# Altium project RADAR_D79_R9_UNIFIED_FLAT.PrjPcb
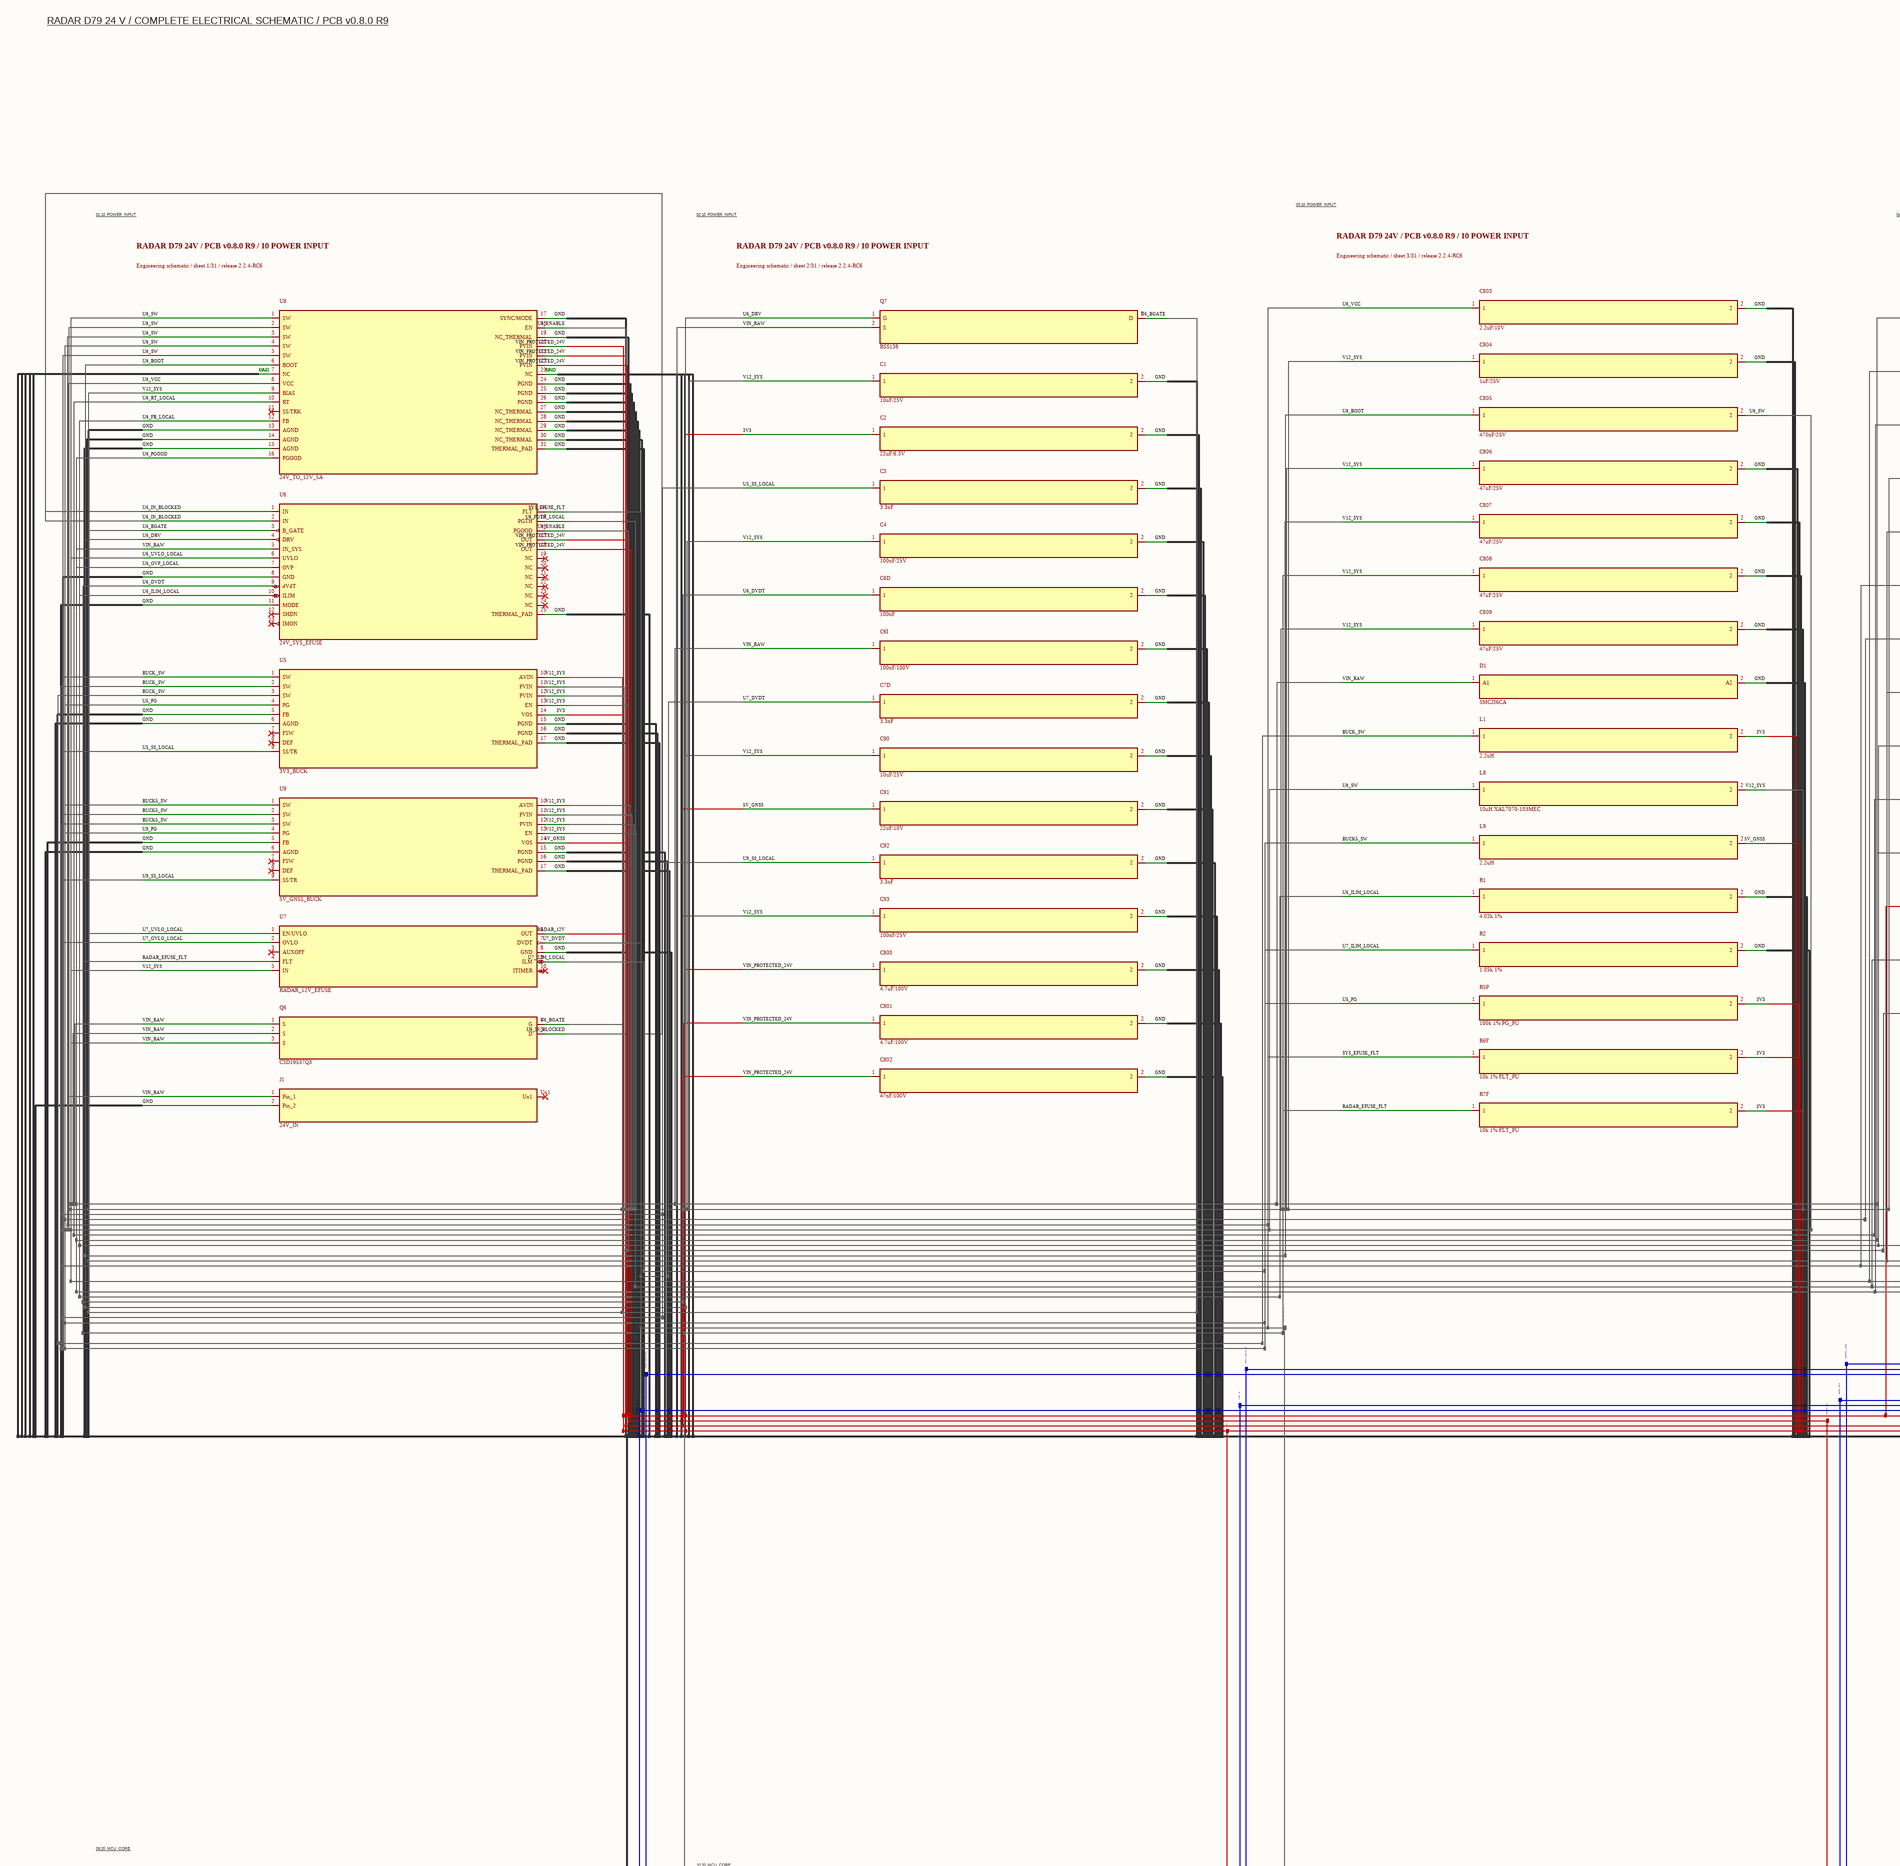
[diagram p0: 00_UNIFIED_CONNECTED_SCHEMATIC.SchDoc, top left]
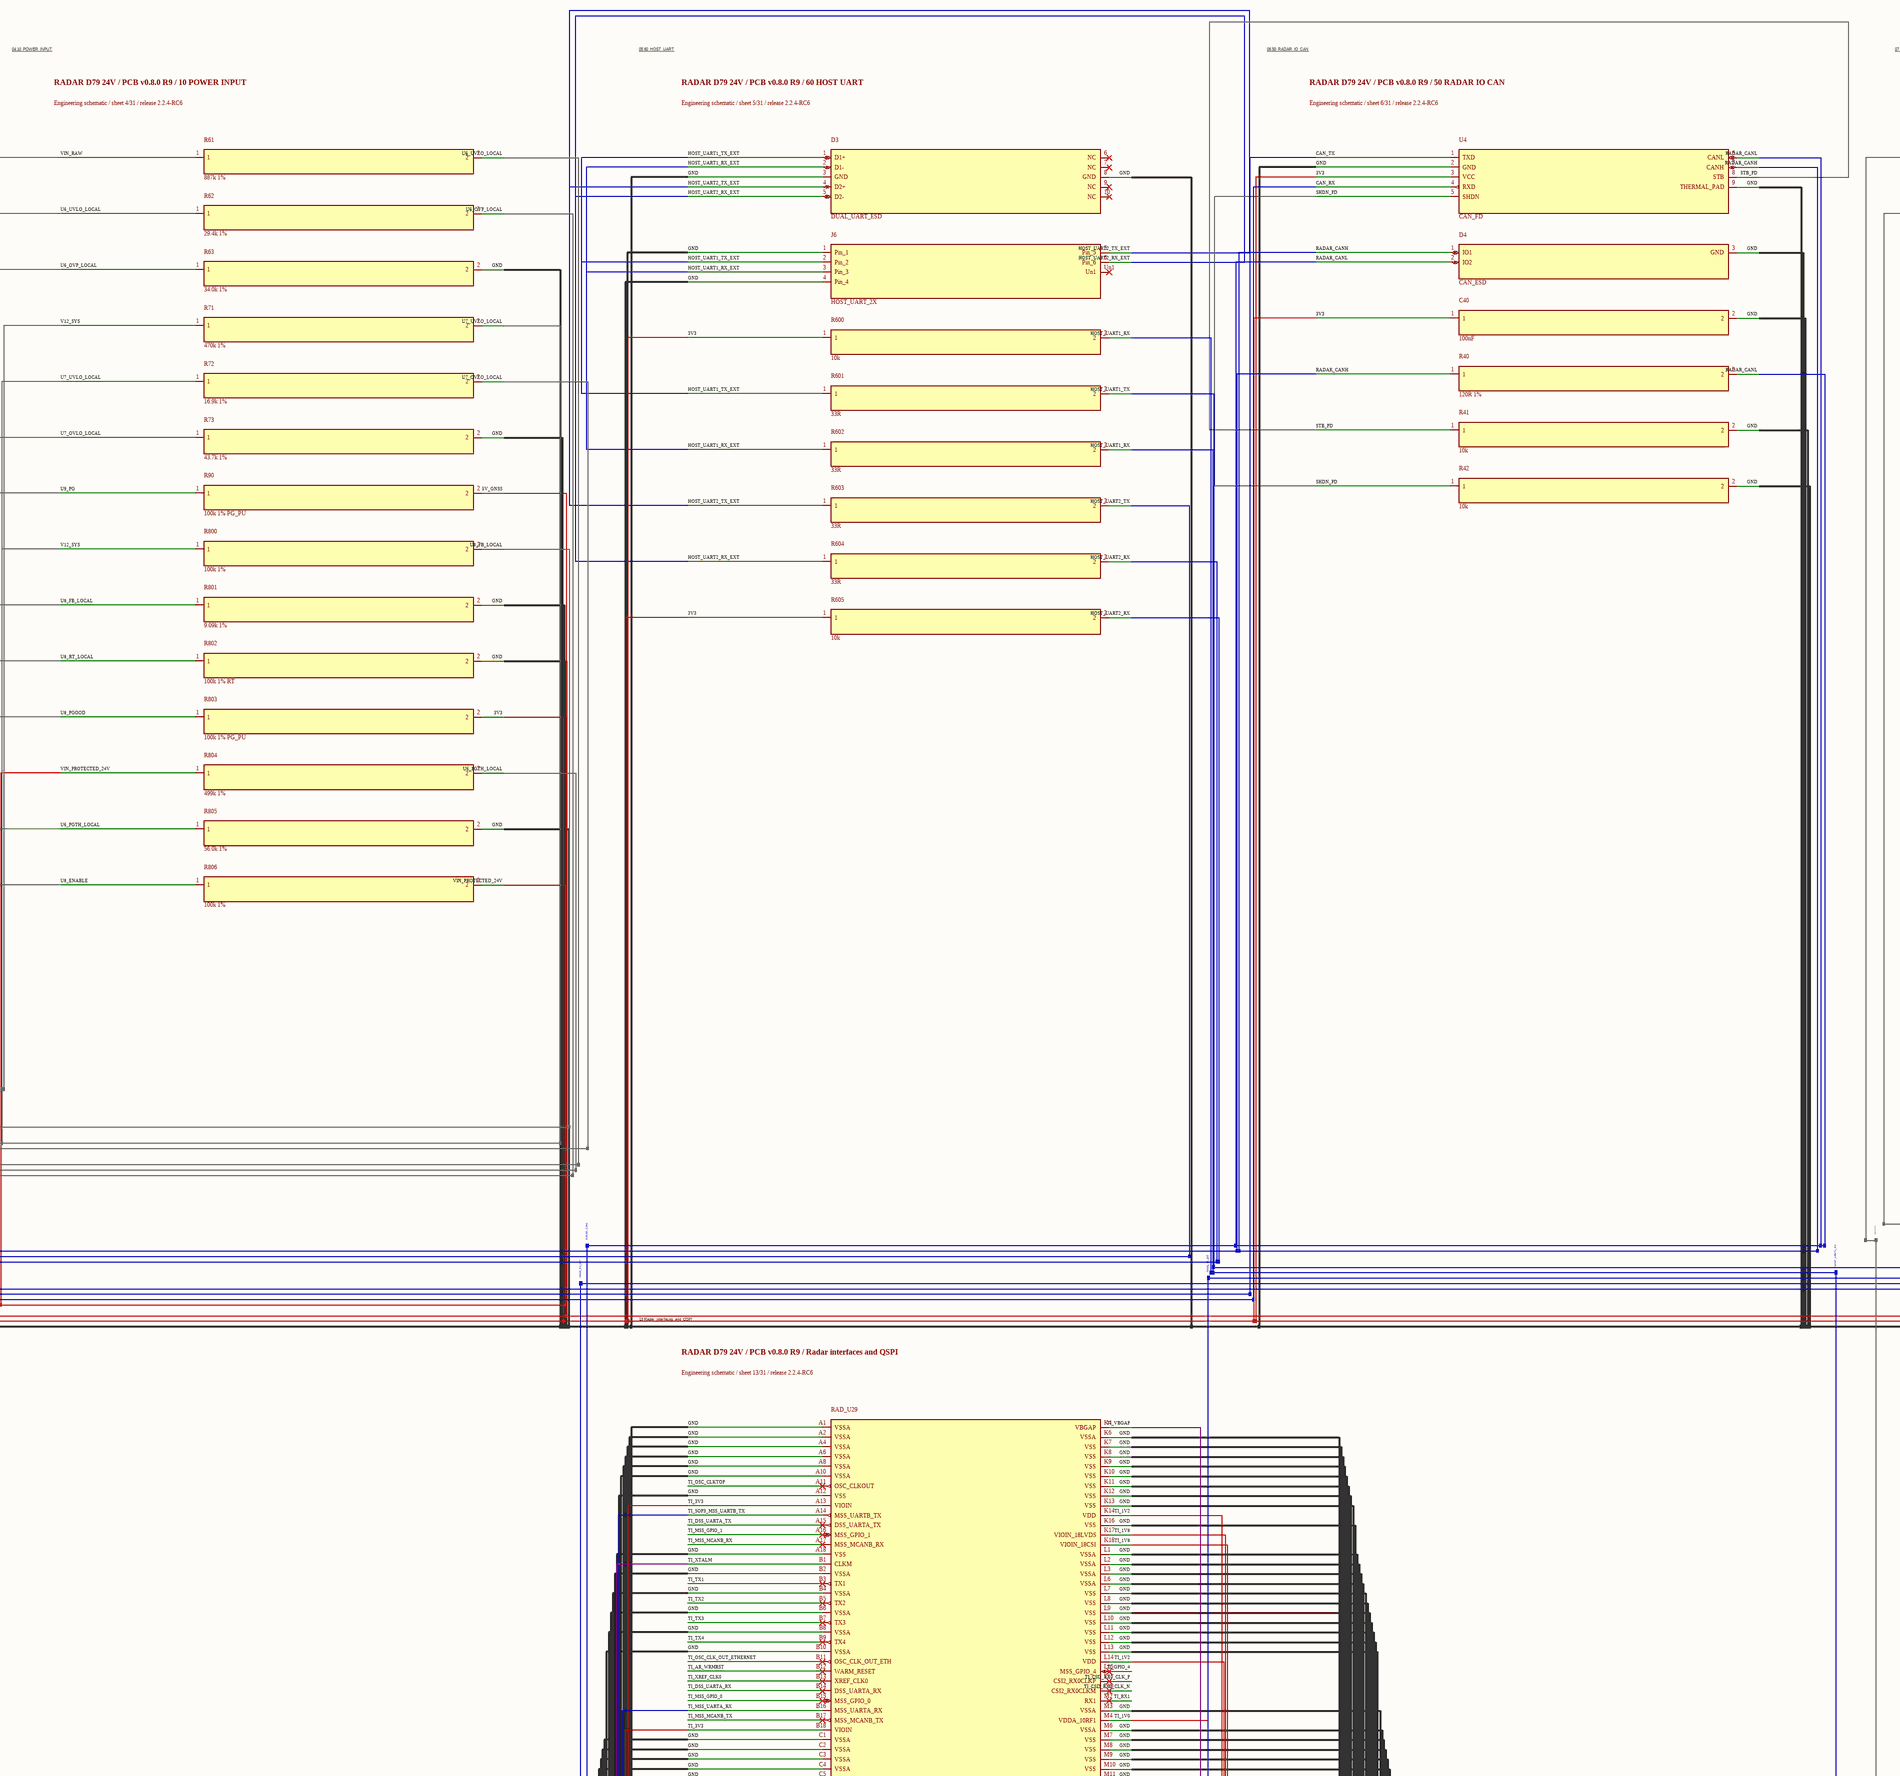
[diagram p1: 00_UNIFIED_CONNECTED_SCHEMATIC.SchDoc, top middle]
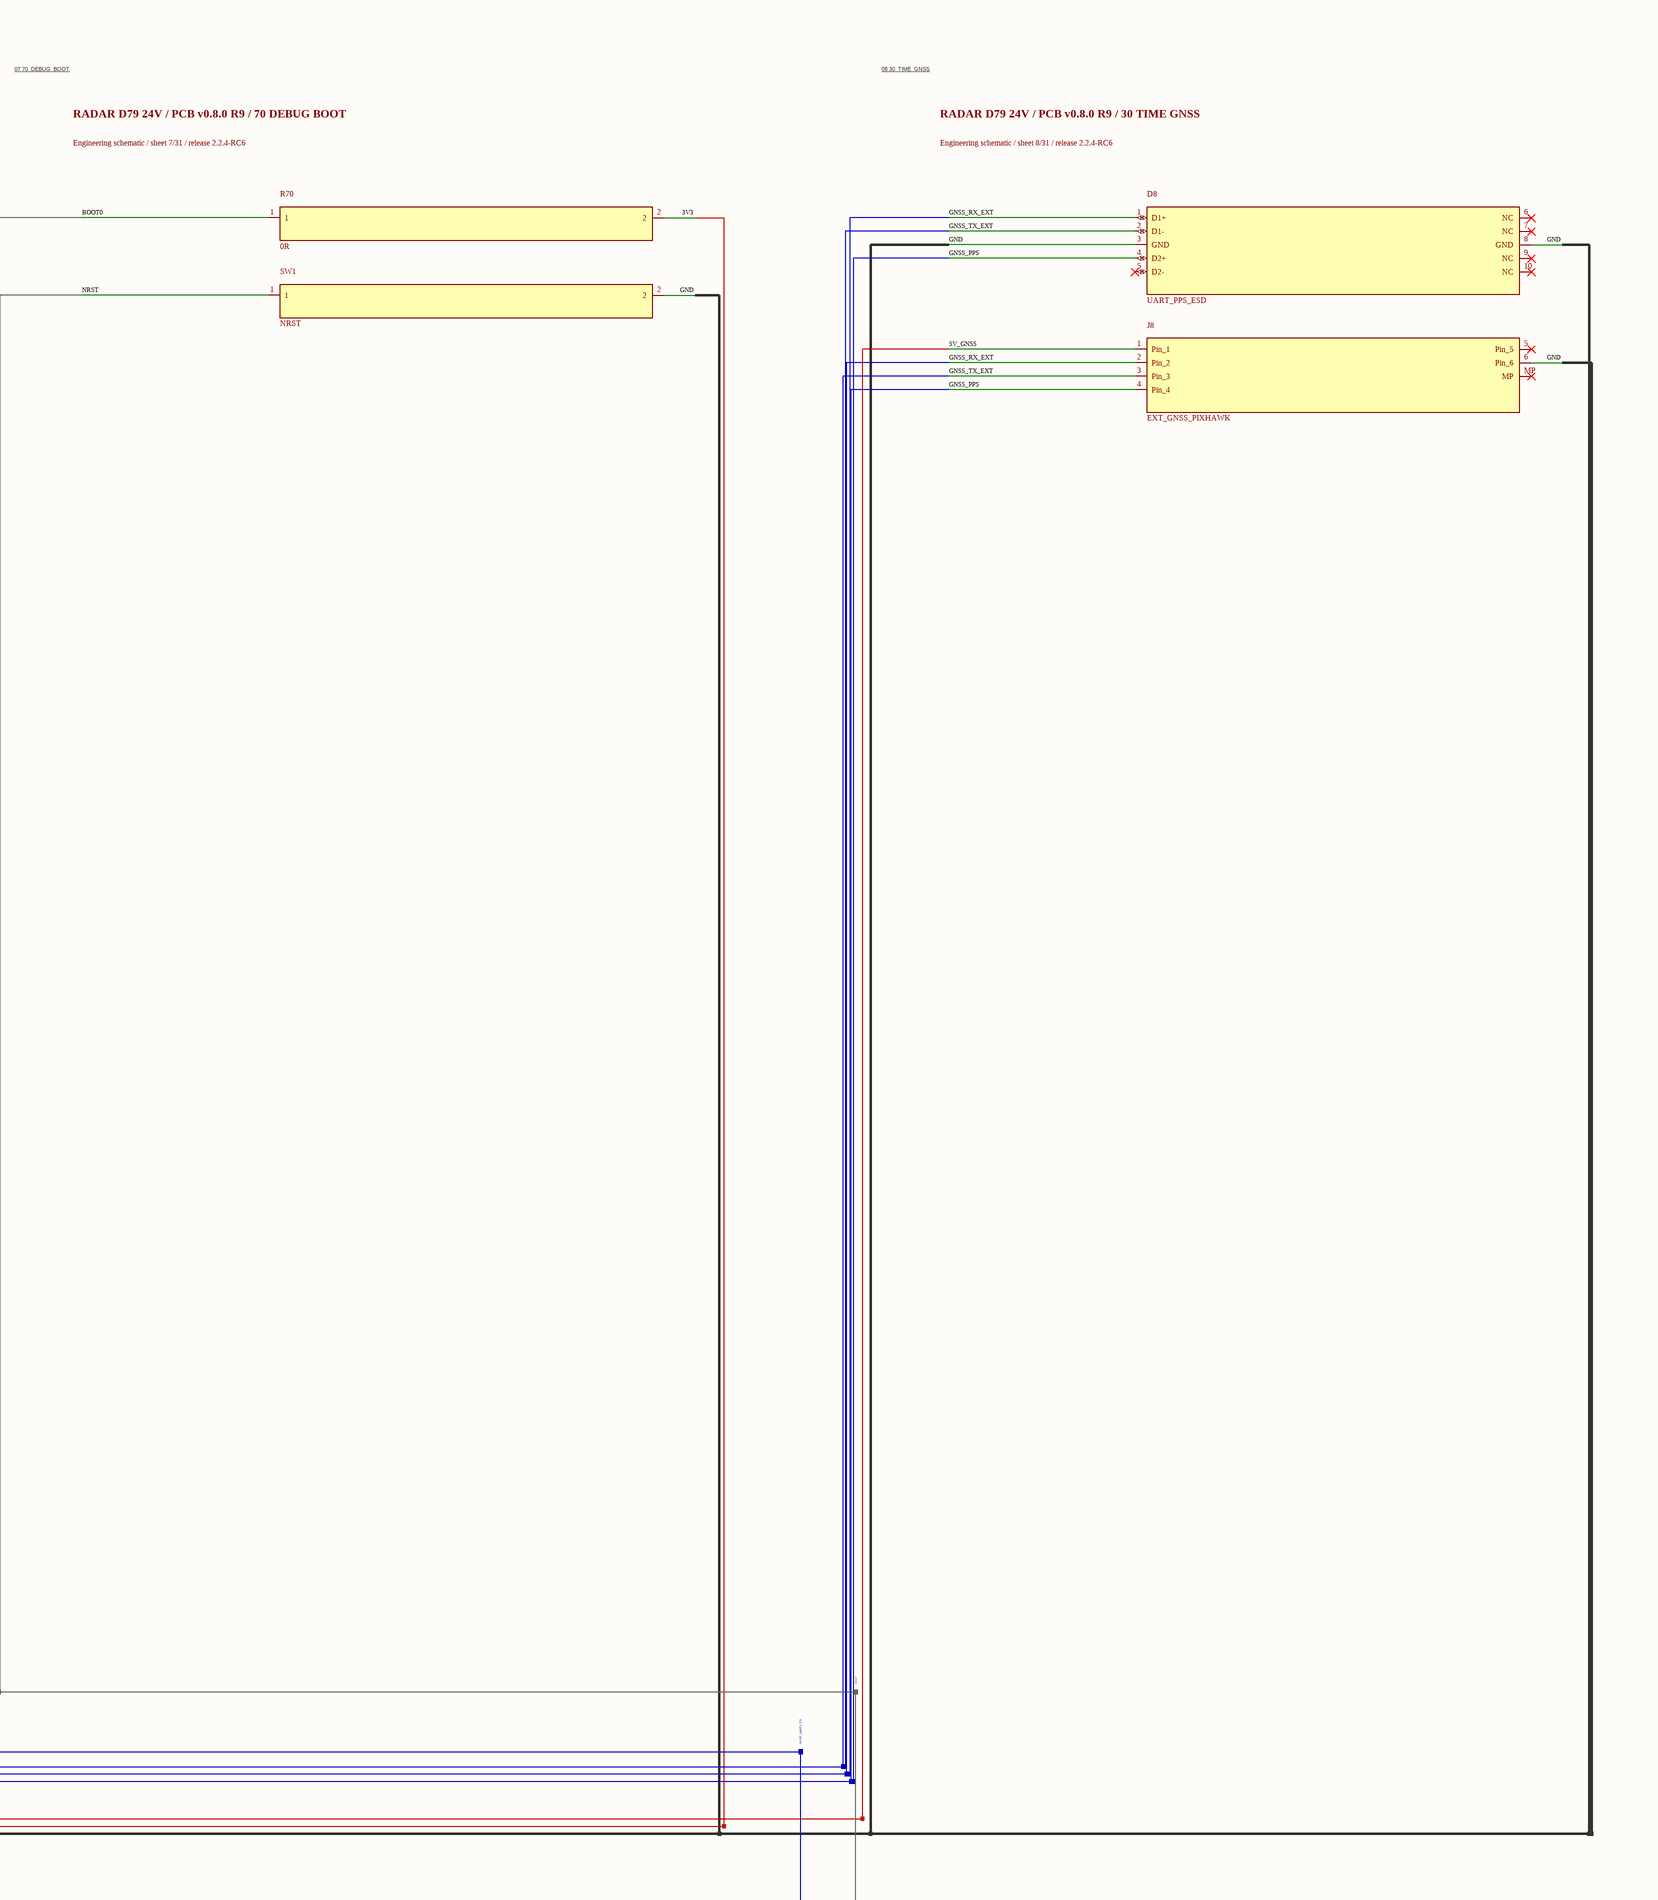
[diagram p2: 00_UNIFIED_CONNECTED_SCHEMATIC.SchDoc, top right]
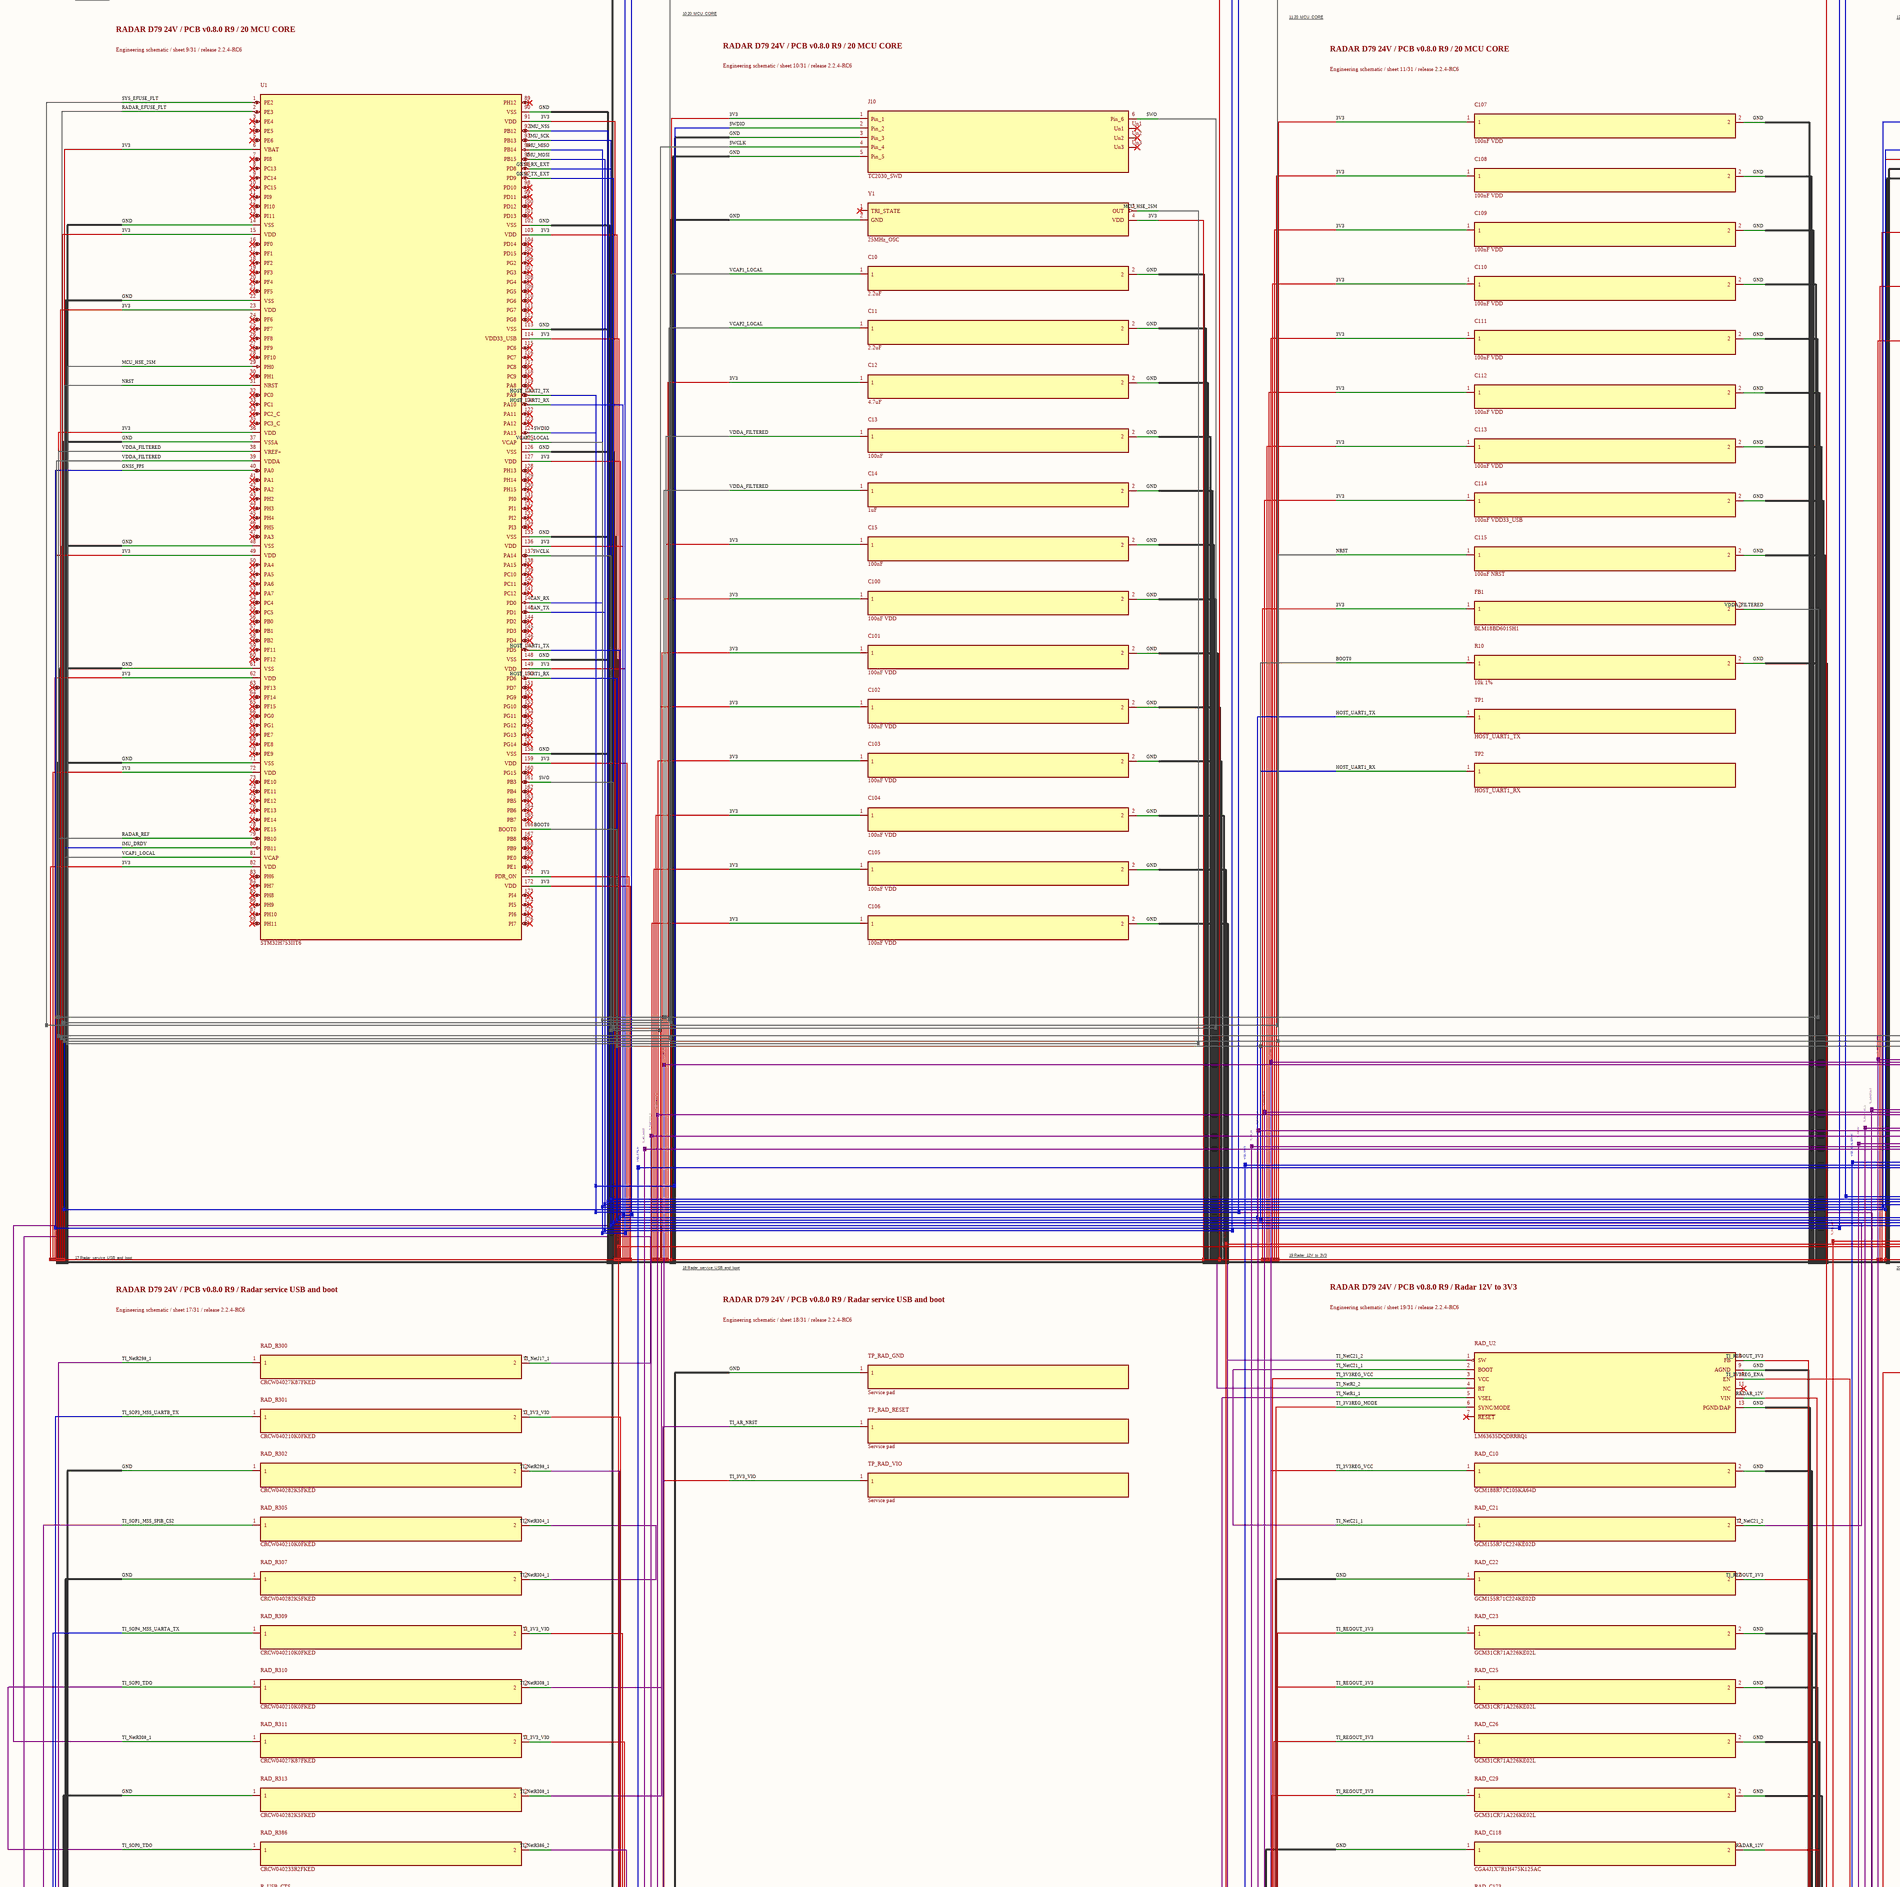
[diagram p3: 00_UNIFIED_CONNECTED_SCHEMATIC.SchDoc, centre left]
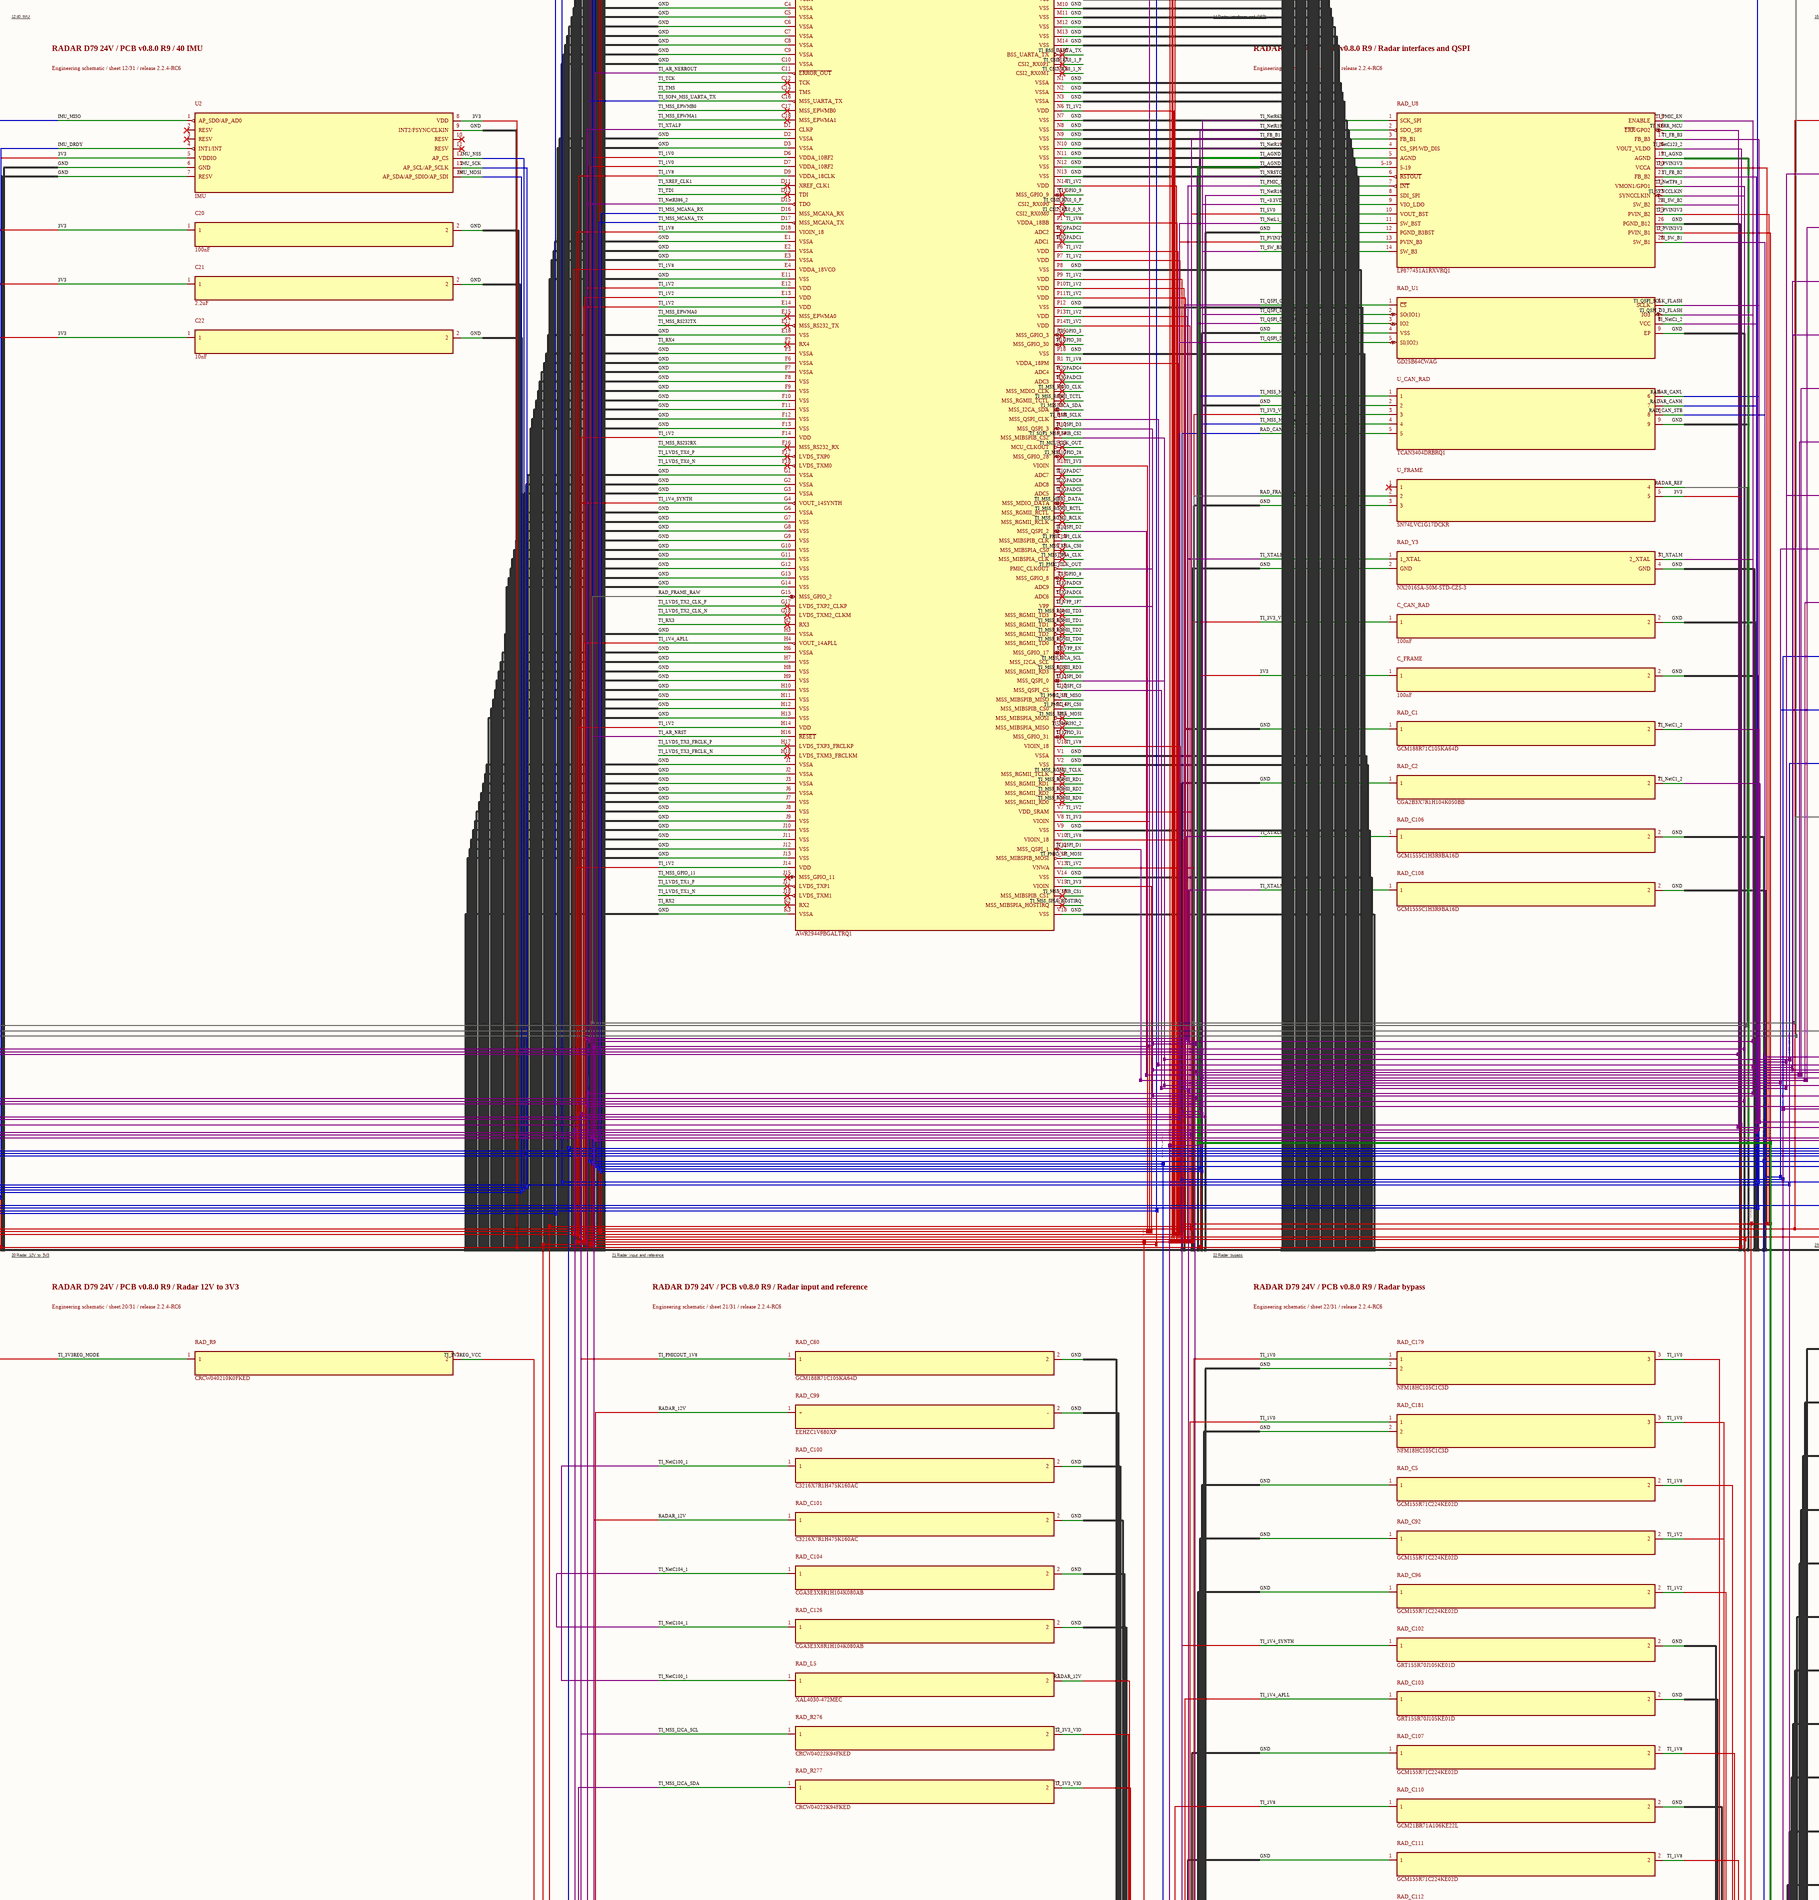
[diagram p4: 00_UNIFIED_CONNECTED_SCHEMATIC.SchDoc, centre middle]
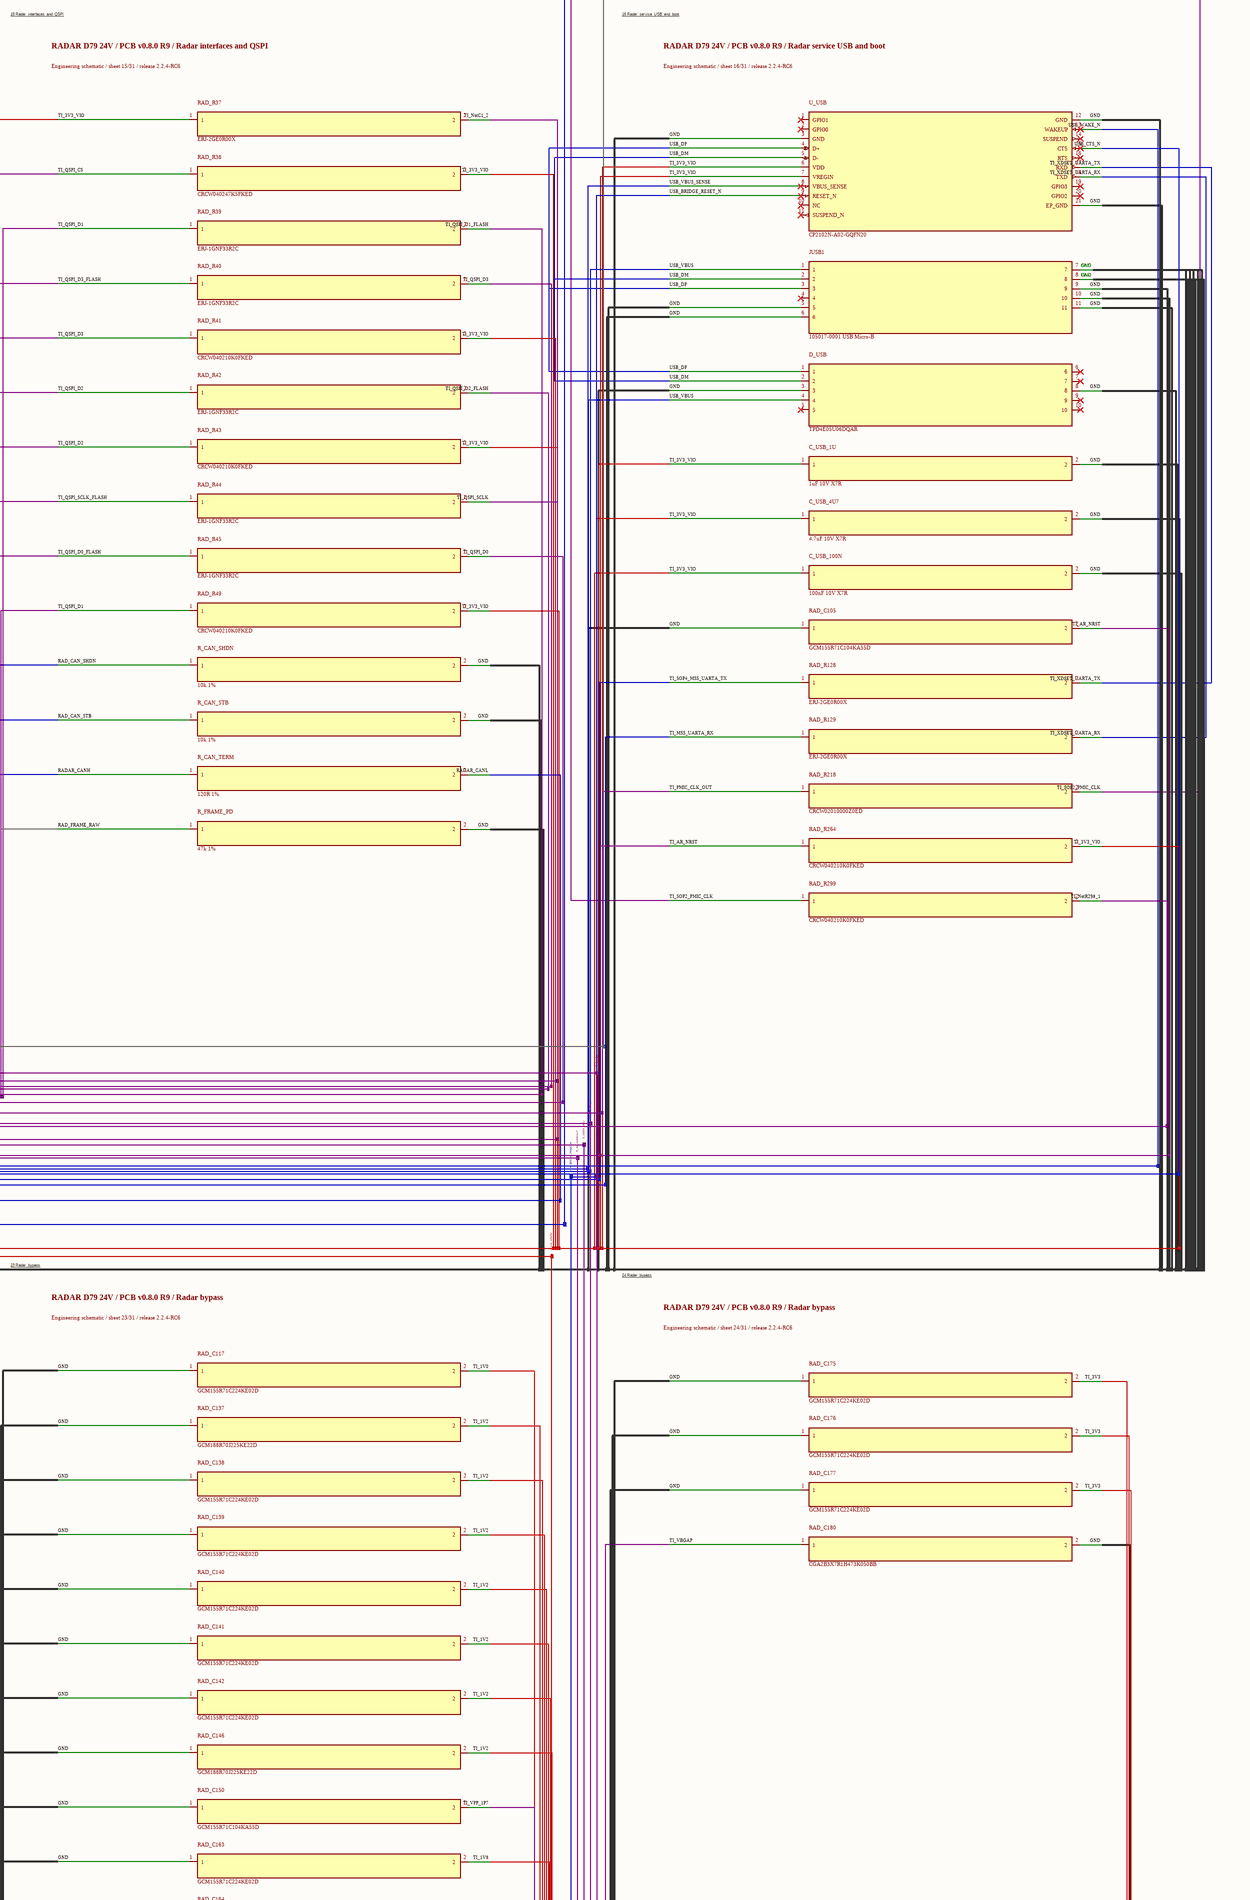
[diagram p5: 00_UNIFIED_CONNECTED_SCHEMATIC.SchDoc, centre right]
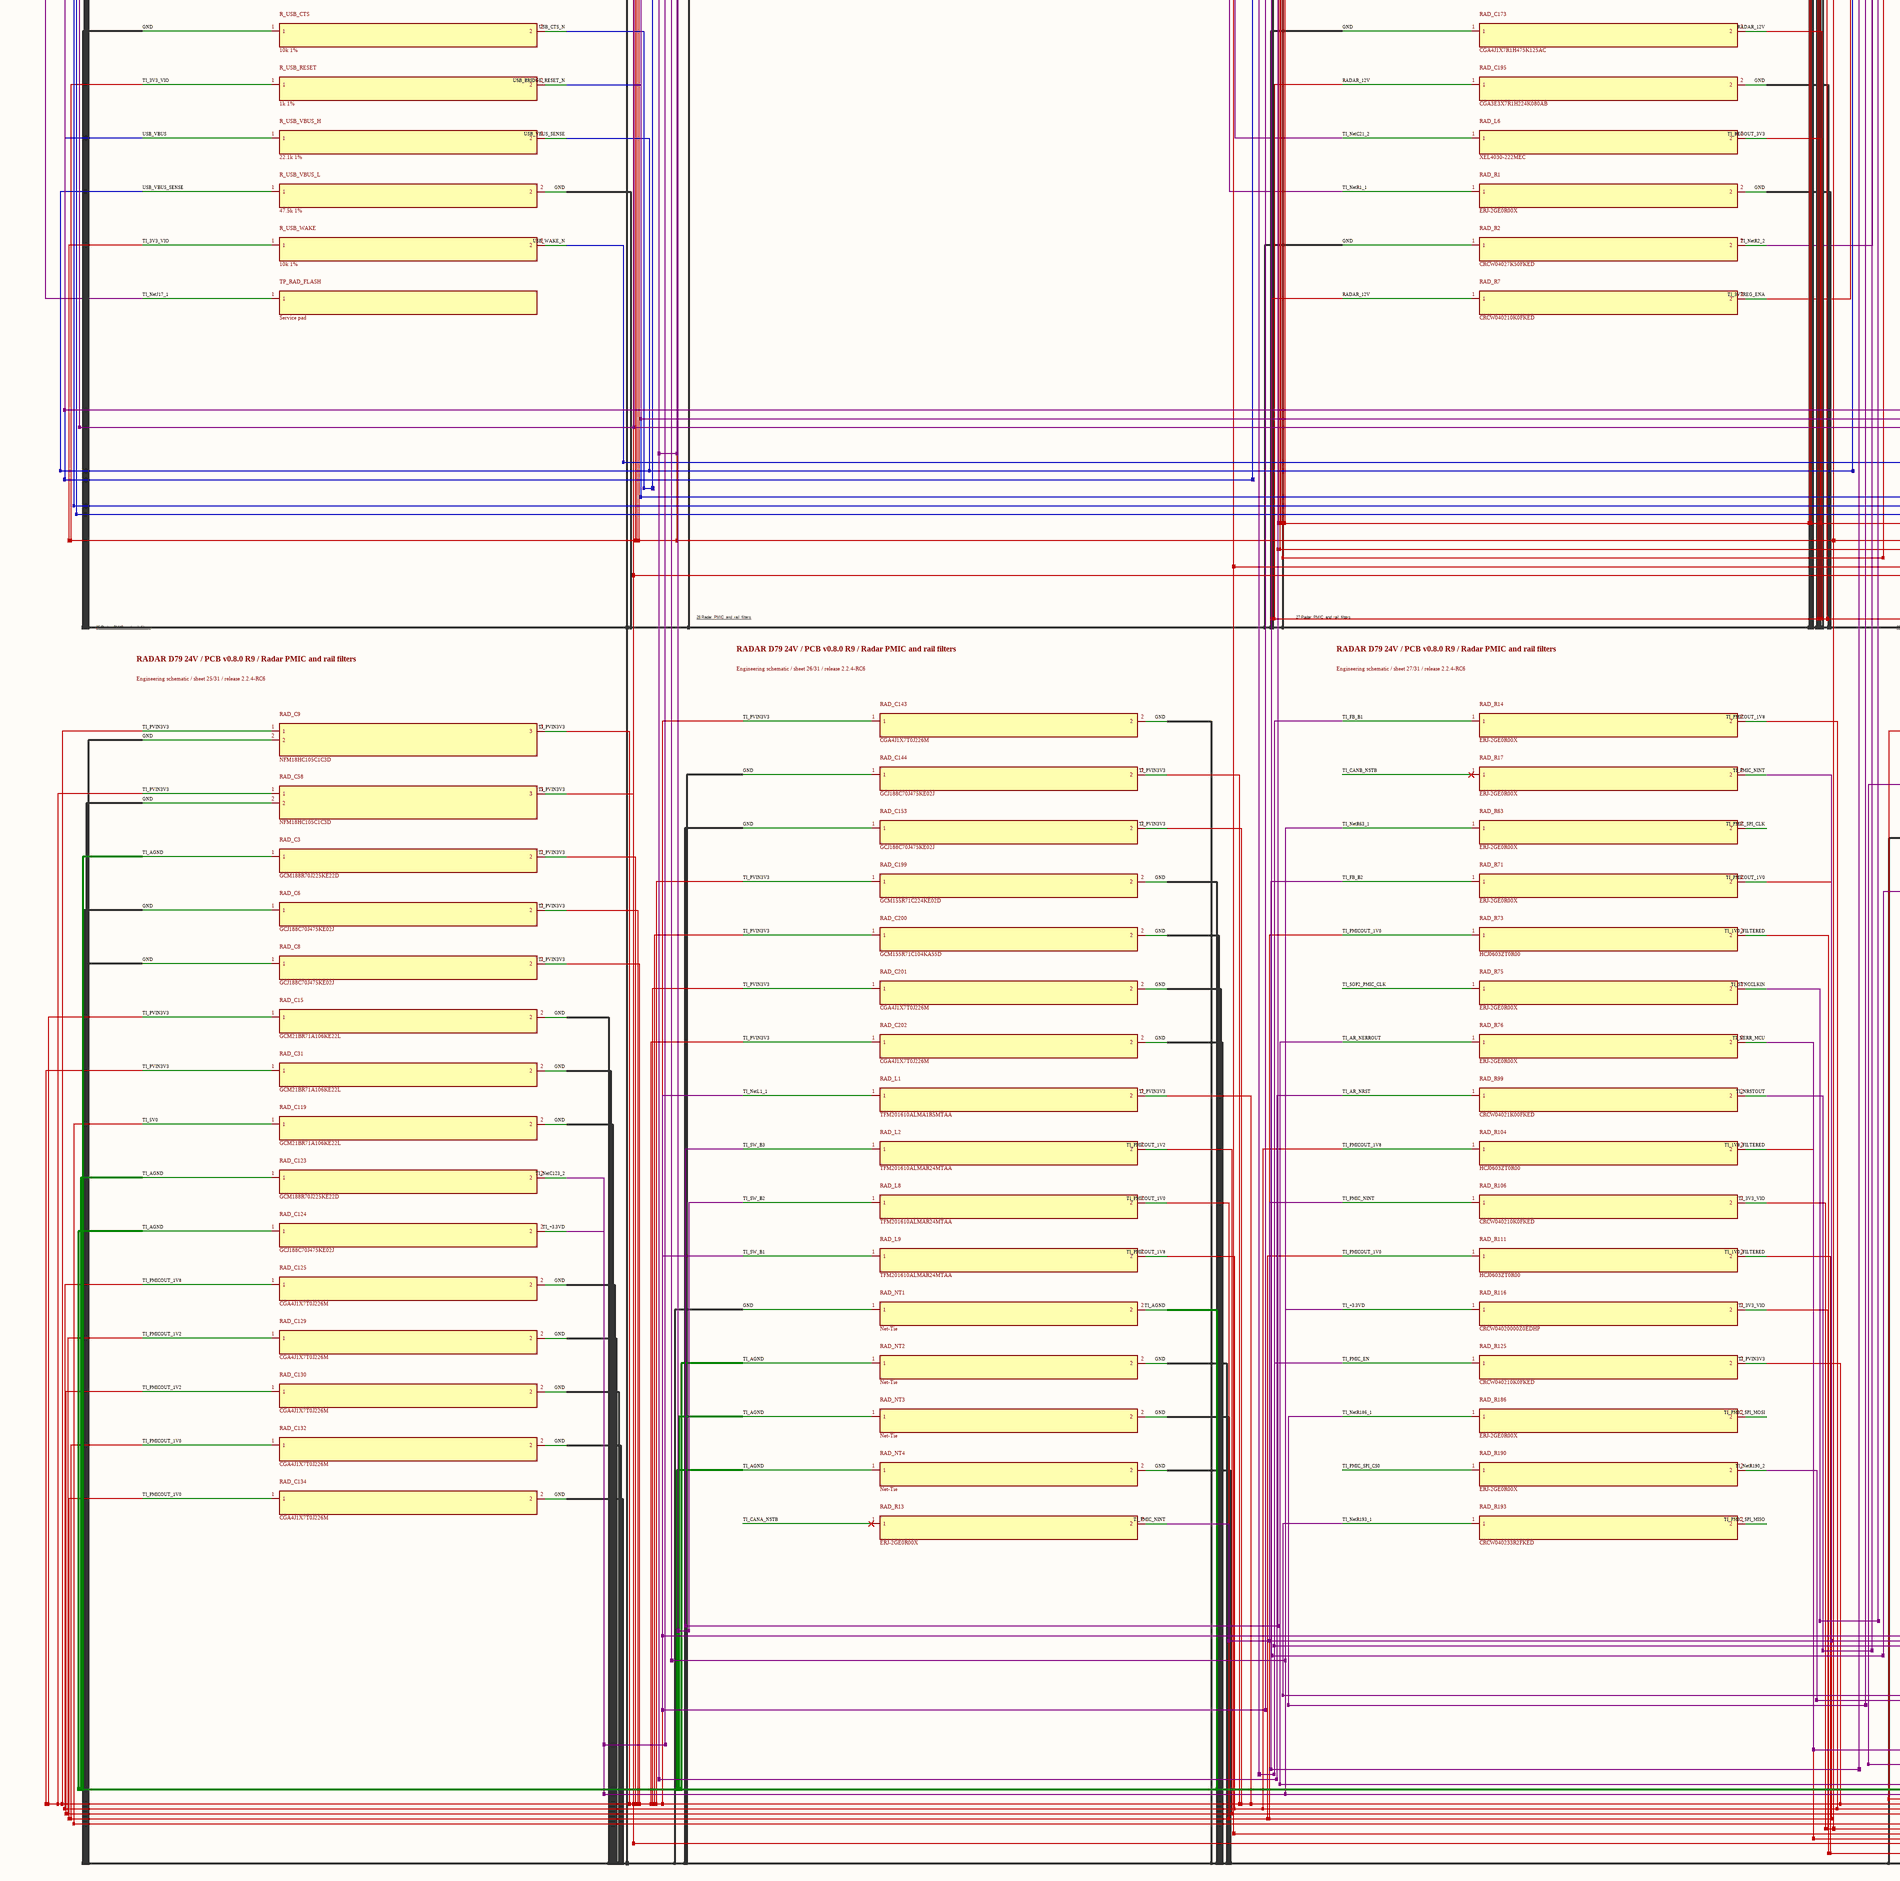
[diagram p6: 00_UNIFIED_CONNECTED_SCHEMATIC.SchDoc, bottom left]
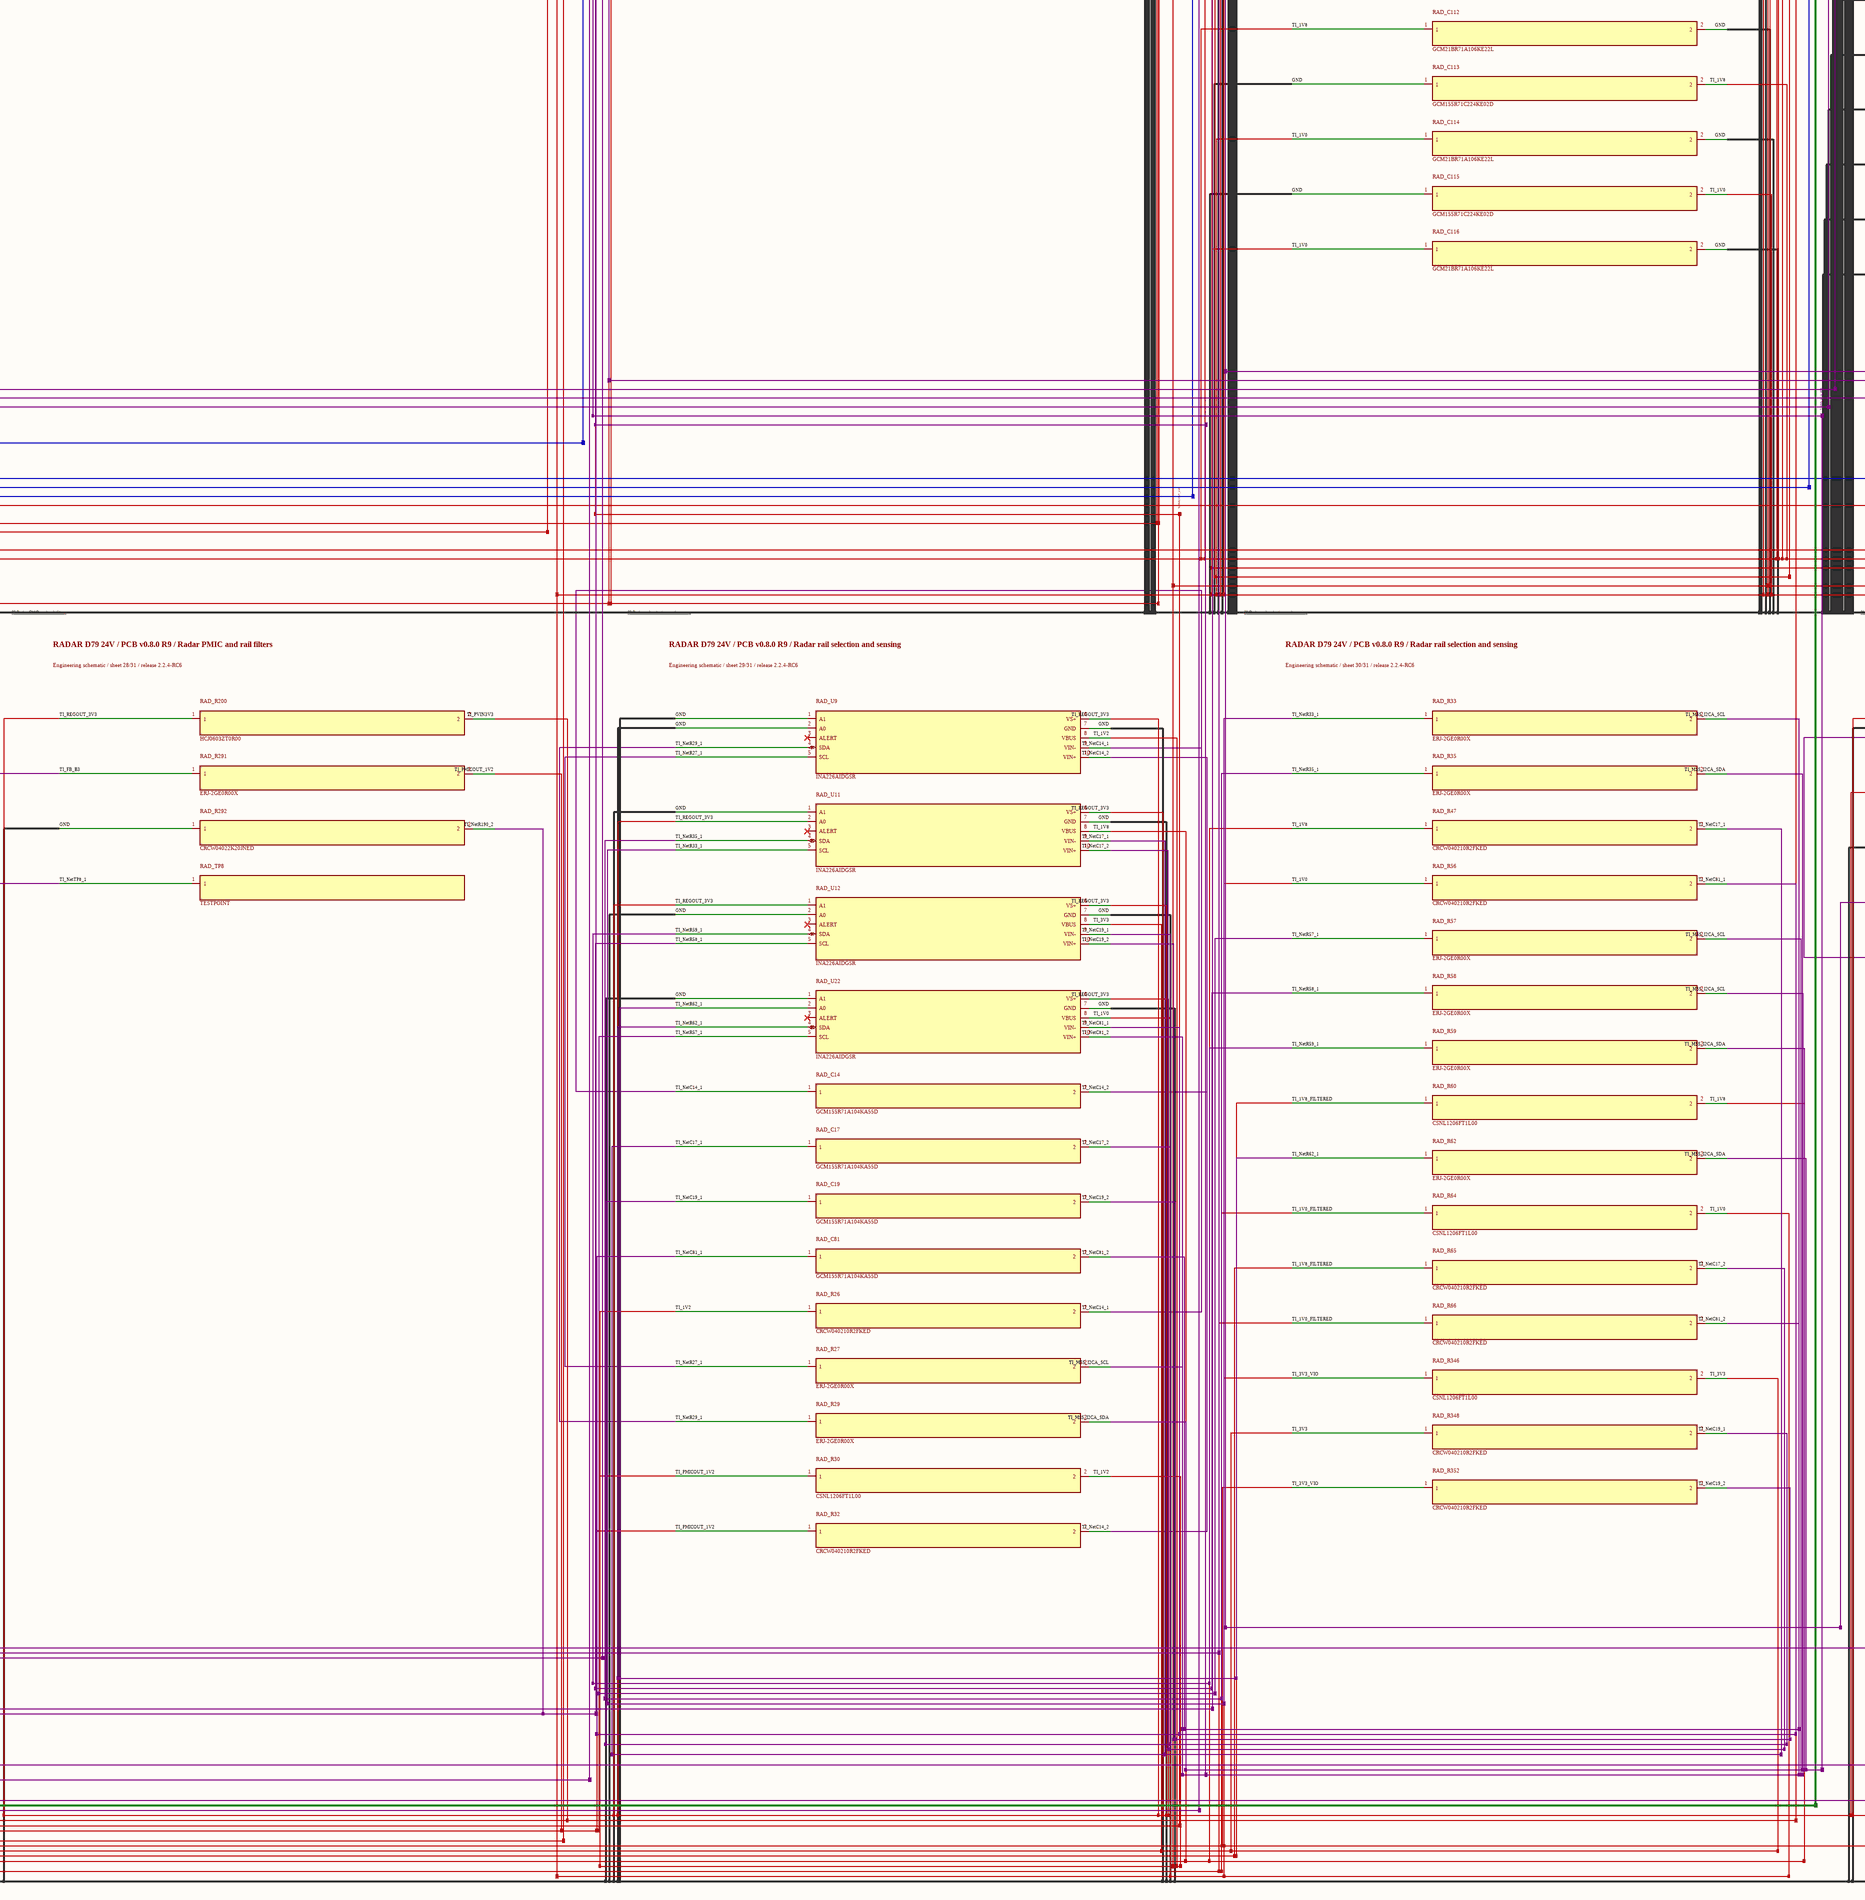
[diagram p7: 00_UNIFIED_CONNECTED_SCHEMATIC.SchDoc, bottom middle]
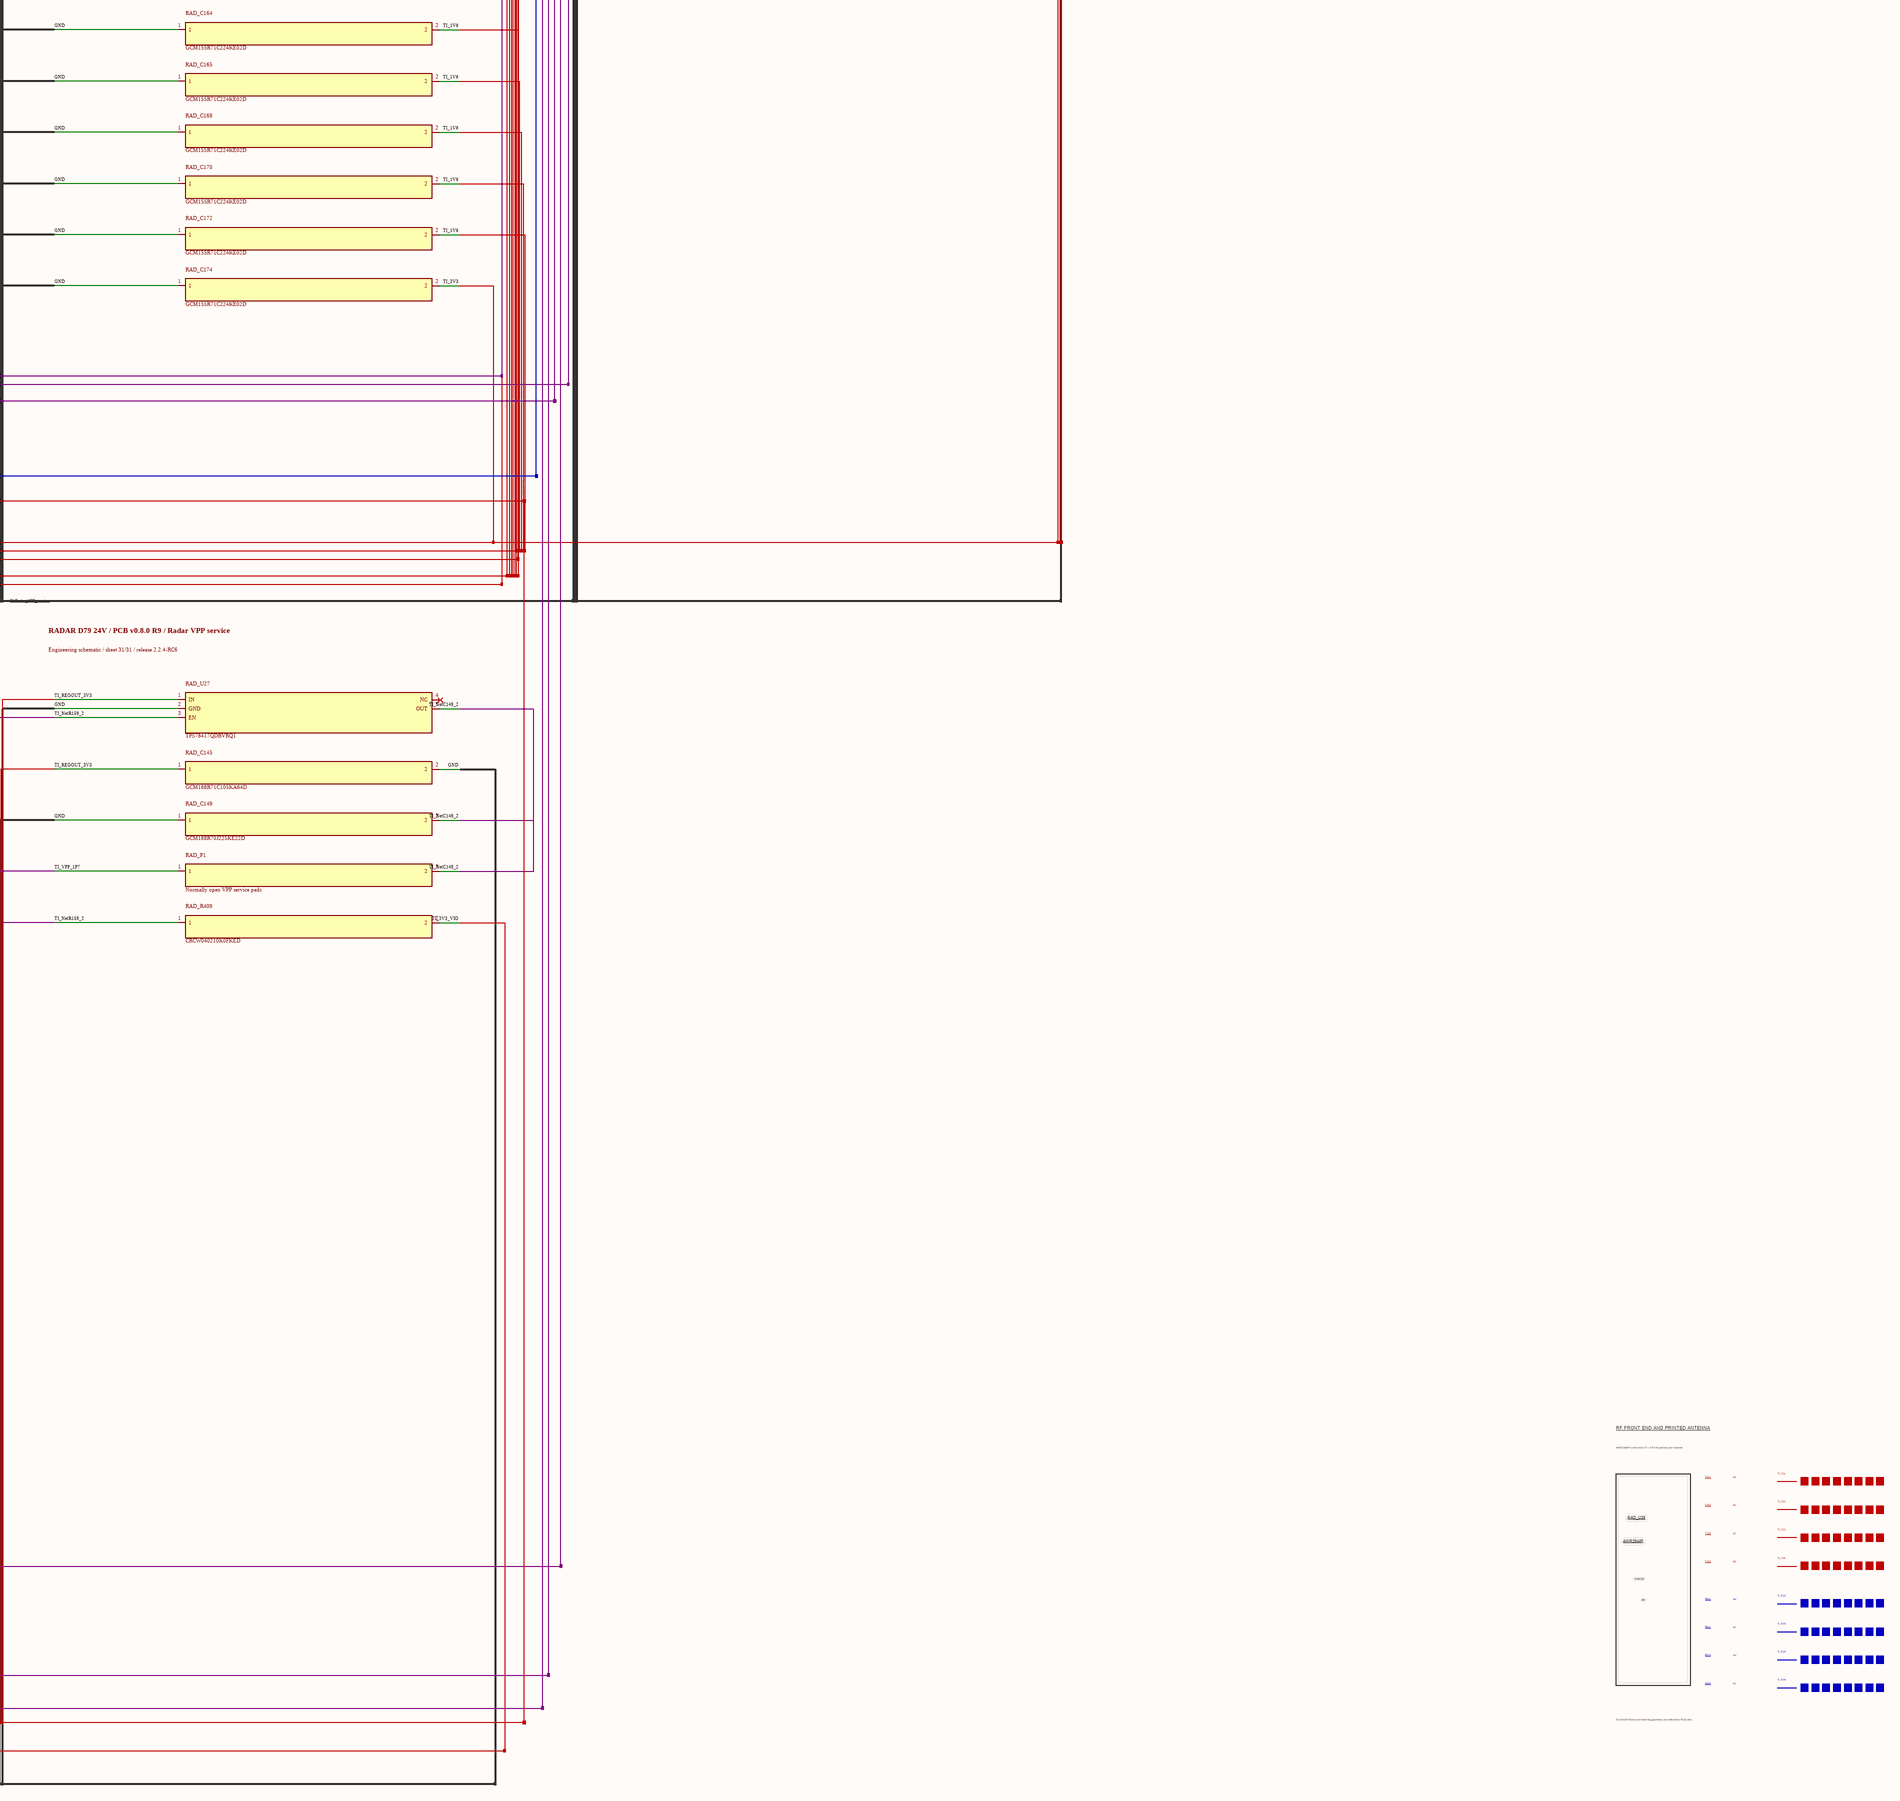
[diagram p8: 00_UNIFIED_CONNECTED_SCHEMATIC.SchDoc, bottom right]
1 sheet, 304 parts. Net scope: global (net labels, ports and power ports of the same name join across sheets).

## Sheet 00_UNIFIED_CONNECTED_SCHEMATIC.SchDoc
size 2400 x 2299 mm

### Parts
C1  10uF/25V  [C_1206_3216Metric]
C2  22uF/6.3V  [C_1206_3216Metric]
C3  3.3nF  [C_0603_1608Metric]
C4  100nF/25V  [C_0603_1608Metric]
C6D  100nF  [C_0603_1608Metric]
C6I  100nF/100V  [C_0603_1608Metric]
C7D  3.3nF  [C_0603_1608Metric]
C10  2.2uF  [C_0603_1608Metric]
C11  2.2uF  [C_0603_1608Metric]
C12  4.7uF  [C_0805_2012Metric]
C13  100nF  [C_0402_1005Metric]
C14  1uF  [C_0603_1608Metric]
C15  100nF  [C_0402_1005Metric]
C20  100nF  [C_0402_1005Metric]
C21  2.2uF  [C_0603_1608Metric]
C22  10nF  [C_0402_1005Metric]
C40  100nF  [C_0402_1005Metric]
C90  10uF/25V  [C_1206_3216Metric]
C91  22uF/10V  [C_1206_3216Metric]
C92  3.3nF  [C_0603_1608Metric]
C93  100nF/25V  [C_0603_1608Metric]
C100  100nF VDD  [C_0402_1005Metric]
C101  100nF VDD  [C_0402_1005Metric]
C102  100nF VDD  [C_0402_1005Metric]
C103  100nF VDD  [C_0402_1005Metric]
C104  100nF VDD  [C_0402_1005Metric]
C105  100nF VDD  [C_0402_1005Metric]
C106  100nF VDD  [C_0402_1005Metric]
C107  100nF VDD  [C_0402_1005Metric]
C108  100nF VDD  [C_0402_1005Metric]
C109  100nF VDD  [C_0402_1005Metric]
C110  100nF VDD  [C_0402_1005Metric]
C111  100nF VDD  [C_0402_1005Metric]
C112  100nF VDD  [C_0402_1005Metric]
C113  100nF VDD  [C_0402_1005Metric]
C114  100nF VDD33_USB  [C_0402_1005Metric]
C115  100nF NRST  [C_0402_1005Metric]
C800  4.7uF/100V  [C_1210_3225Metric]
C801  4.7uF/100V  [C_1210_3225Metric]
C802  47nF/100V  [C_0603_1608Metric]
C803  2.2uF/10V  [C_0603_1608Metric]
C804  1uF/25V  [C_0603_1608Metric]
C805  470nF/25V  [C_0603_1608Metric]
C806  47uF/25V  [C_1210_3225Metric]
C807  47uF/25V  [C_1210_3225Metric]
C808  47uF/25V  [C_1210_3225Metric]
C809  47uF/25V  [C_1210_3225Metric]
C_CAN_RAD  100nF  [C_0402_1005Metric]
C_FRAME  100nF  [C_0402_1005Metric]
C_USB_1U  1uF 10V X7R  [C_0603_1608Metric]
C_USB_4U7  4.7uF 10V X7R  [C_0603_1608Metric]
C_USB_100N  100nF 10V X7R  [C_0402_1005Metric]
D1  SMCJ36CA  [D_SMC]
D3  DUAL_UART_ESD  [USON-10_2.5x1.0mm_P0.5mm]
D4  CAN_ESD  [SOT-23]
D8  UART_PPS_ESD  [USON-10_2.5x1.0mm_P0.5mm]
D_USB  TPD4E05U06DQAR  [USON-10_2.5x1.0mm_P0.5mm]
FB1  BLM18BD601SH1  [L_0603_1608Metric]
J1  24V_IN  [Molex_43650-0200_RA_THT_2P]
J6  HOST_UART_2X  [Molex_43045-0600_RA_THT_6P]
J8  EXT_GNSS_PIXHAWK  [JST_GH_SM06B-GHS-TB_1x06-1MP_P1.25mm_Horizontal]
J10  TC2030_SWD  [TagConnect_TC2030_NL]
JUSB1  105017-0001 USB Micro-B  [CONN_105017-0001]
L1  2.2uH  [Coilcraft_XFL4020_4x4]
L8  10uH XAL7070-103MEC  [L_Coilcraft_XAL7070-XXX]
L9  2.2uH  [Coilcraft_XFL4020_4x4]
Q6  CSD19537Q3  [VSON-8_3.3x3.3mm_P0.65mm_NexFET]
Q7  BSS138  [SOT-23]
R1  4.02k 1%  [R_0603_1608Metric]
R2  1.05k 1%  [R_0603_1608Metric]
R5P  100k 1% PG_PU  [R_0603_1608Metric]
R6F  10k 1% FLT_PU  [R_0603_1608Metric]
R7F  10k 1% FLT_PU  [R_0603_1608Metric]
R10  10k 1%  [R_0603_1608Metric]
R40  120R 1%  [R_0603_1608Metric]
R41  10k  [R_0603_1608Metric]
R42  10k  [R_0603_1608Metric]
R61  887k 1%  [R_0603_1608Metric]
R62  29.4k 1%  [R_0603_1608Metric]
R63  34.0k 1%  [R_0603_1608Metric]
R70  0R  [R_0603_1608Metric]
R71  470k 1%  [R_0603_1608Metric]
R72  16.9k 1%  [R_0603_1608Metric]
R73  43.7k 1%  [R_0603_1608Metric]
R90  100k 1% PG_PU  [R_0603_1608Metric]
R600  10k  [R_0603_1608Metric]
R601  33R  [R_0402_1005Metric]
R602  33R  [R_0402_1005Metric]
R603  33R  [R_0402_1005Metric]
R604  33R  [R_0402_1005Metric]
R605  10k  [R_0603_1608Metric]
R800  100k 1%  [R_0603_1608Metric]
R801  9.09k 1%  [R_0603_1608Metric]
R802  100k 1% RT  [R_0603_1608Metric]
R803  100k 1% PG_PU  [R_0603_1608Metric]
R804  499k 1%  [R_0603_1608Metric]
R805  56.0k 1%  [R_0603_1608Metric]
R806  100k 1%  [R_0603_1608Metric]
R_CAN_SHDN  10k 1%  [R_0603_1608Metric]
R_CAN_STB  10k 1%  [R_0603_1608Metric]
R_CAN_TERM  120R 1%  [R_0603_1608Metric]
R_FRAME_PD  47k 1%  [R_0603_1608Metric]
R_USB_CTS  10k 1%  [R_0402_1005Metric]
R_USB_RESET  1k 1%  [R_0402_1005Metric]
R_USB_VBUS_H  22.1k 1%  [R_0402_1005Metric]
R_USB_VBUS_L  47.5k 1%  [R_0402_1005Metric]
R_USB_WAKE  10k 1%  [R_0402_1005Metric]
RAD_C1  GCM188R71C105KA64D  [0603L]
RAD_C2  CGA2B3X7R1H104K050BB  [0402L]
RAD_C3  GCM188R70J225KE22D  [0603L]
RAD_C5  GCM155R71C224KE02D  [0402L]
RAD_C6  GCJ188C70J475KE02J  [FP-GCJ188C70J475KE02J_0603-MFG]
RAD_C8  GCJ188C70J475KE02J  [FP-GCJ188C70J475KE02J_0603-MFG]
RAD_C9  NFM18HC105C1C3D  [FP-NFM18HC105C1C3D_0603-MFG]
RAD_C10  GCM188R71C105KA64D  [0603L]
RAD_C14  GCM155R71A104KA55D  [0402L]
RAD_C15  GCM21BR71A106KE22L  [0805L]
RAD_C17  GCM155R71A104KA55D  [0402L]
RAD_C19  GCM155R71A104KA55D  [0402L]
RAD_C21  GCM155R71C224KE02D  [0402L]
RAD_C22  GCM155R71C224KE02D  [0402L]
RAD_C23  GCM31CR71A226KE02L  [1206_180L]
RAD_C25  GCM31CR71A226KE02L  [1206_180L]
RAD_C26  GCM31CR71A226KE02L  [1206_180L]
RAD_C29  GCM31CR71A226KE02L  [1206_180L]
RAD_C31  GCM21BR71A106KE22L  [0805L]
RAD_C58  NFM18HC105C1C3D  [FP-NFM18HC105C1C3D_0603-MFG]
RAD_C60  GCM188R71C105KA64D  [0603L]
RAD_C81  GCM155R71A104KA55D  [0402L]
RAD_C92  GCM155R71C224KE02D  [0402L]
RAD_C96  GCM155R71C224KE02D  [0402L]
RAD_C99  EEHZC1V680XP  [SM_RADIAL_6.3BMM]
RAD_C100  C3216X7R1H475K160AC  [1206_180L]
RAD_C101  C3216X7R1H475K160AC  [1206_180L]
RAD_C102  GRT155R70J105KE01D  [FP-GRT155R70J105KE01D_0402-MFG]
RAD_C103  GRT155R70J105KE01D  [FP-GRT155R70J105KE01D_0402-MFG]
RAD_C104  CGA3E3X8R1H104K080AB  [0603L]
RAD_C105  GCM155R71C104KA55D  [0402L]
RAD_C106  GCM1555C1H3R9BA16D  [FP-GCM1555C1H3R9BA16D_0402-MFG]
RAD_C107  GCM155R71C224KE02D  [0402L]
RAD_C108  GCM1555C1H3R9BA16D  [FP-GCM1555C1H3R9BA16D_0402-MFG]
RAD_C110  GCM21BR71A106KE22L  [0805L]
RAD_C111  GCM155R71C224KE02D  [0402L]
RAD_C112  GCM21BR71A106KE22L  [0805L]
RAD_C113  GCM155R71C224KE02D  [0402L]
RAD_C114  GCM21BR71A106KE22L  [0805L]
RAD_C115  GCM155R71C224KE02D  [0402L]
RAD_C116  GCM21BR71A106KE22L  [0805L]
RAD_C117  GCM155R71C224KE02D  [0402L]
RAD_C118  CGA4J1X7R1H475K125AC  [FP-CGA4J1X7R1H475K125AC_0805-MFG]
RAD_C119  GCM21BR71A106KE22L  [0805L]
RAD_C123  GCM188R70J225KE22D  [0603L]
RAD_C124  GCJ188C70J475KE02J  [FP-GCJ188C70J475KE02J_0603-MFG]
RAD_C125  CGA4J1X7T0J226M  [0805_155]
RAD_C126  CGA3E3X8R1H104K080AB  [0603L]
RAD_C129  CGA4J1X7T0J226M  [0805_155]
RAD_C130  CGA4J1X7T0J226M  [0805_155]
RAD_C132  CGA4J1X7T0J226M  [0805_155]
RAD_C134  CGA4J1X7T0J226M  [0805_155]
RAD_C137  GCM188R70J225KE22D  [0603L]
RAD_C138  GCM155R71C224KE02D  [0402L]
RAD_C139  GCM155R71C224KE02D  [0402L]
RAD_C140  GCM155R71C224KE02D  [0402L]
RAD_C141  GCM155R71C224KE02D  [0402L]
RAD_C142  GCM155R71C224KE02D  [0402L]
RAD_C143  CGA4J1X7T0J226M  [0805_155]
RAD_C144  GCJ188C70J475KE02J  [FP-GCJ188C70J475KE02J_0603-MFG]
RAD_C145  GCM188R71C105KA64D  [0603L]
RAD_C146  GCM188R70J225KE22D  [0603L]
RAD_C149  GCM188R70J225KE22D  [0603L]
RAD_C150  GCM155R71C104KA55D  [0402L]
RAD_C153  GCJ188C70J475KE02J  [FP-GCJ188C70J475KE02J_0603-MFG]
RAD_C163  GCM155R71C224KE02D  [0402L]
RAD_C164  GCM155R71C224KE02D  [0402L]
RAD_C165  GCM155R71C224KE02D  [0402L]
RAD_C168  GCM155R71C224KE02D  [0402L]
RAD_C170  GCM155R71C224KE02D  [0402L]
RAD_C172  GCM155R71C224KE02D  [0402L]
RAD_C173  CGA4J1X7R1H475K125AC  [FP-CGA4J1X7R1H475K125AC_0805-MFG]
RAD_C174  GCM155R71C224KE02D  [0402L]
RAD_C175  GCM155R71C224KE02D  [0402L]
RAD_C176  GCM155R71C224KE02D  [0402L]
RAD_C177  GCM155R71C224KE02D  [0402L]
RAD_C179  NFM18HC105C1C3D  [FP-NFM18HC105C1C3D_0603-MFG]
RAD_C180  CGA2B3X7R1H473K050BB  [0402L]
RAD_C181  NFM18HC105C1C3D  [FP-NFM18HC105C1C3D_0603-MFG]
RAD_C195  CGA3E3X7R1H224K080AB  [0603L]
RAD_C199  GCM155R71C224KE02D  [0402L]
RAD_C200  GCM155R71C104KA55D  [0402L]
RAD_C201  CGA4J1X7T0J226M  [0805_155]
RAD_C202  CGA4J1X7T0J226M  [0805_155]
RAD_L1  TFM201610ALMA1R5MTAA  [TFM201610ALMA]
RAD_L2  TFM201610ALMAR24MTAA  [FP-TFM201610ALMAR24MTAA_0806 (2016 Metric)-MFG]
RAD_L5  XAL4030-472MEC  [FP-XAL4030-472MEC_SMD2-MFG]
RAD_L6  XEL4030-222MEC  [FP-XEL4030-222MEC_SMT2_4MM0_4MM0-MFG]
RAD_L8  TFM201610ALMAR24MTAA  [FP-TFM201610ALMAR24MTAA_0806 (2016 Metric)-MFG]
RAD_L9  TFM201610ALMAR24MTAA  [FP-TFM201610ALMAR24MTAA_0806 (2016 Metric)-MFG]
RAD_NT1  Net-Tie  [Net-Tie_50milWide_30milLong]  (net tie, no BOM)
RAD_NT2  Net-Tie  [Net-Tie_50milWide_30milLong]  (net tie, no BOM)
RAD_NT3  Net-Tie  [Net-Tie_50milWide_30milLong]  (net tie, no BOM)
RAD_NT4  Net-Tie  [Net-Tie_50milWide_30milLong]  (net tie, no BOM)
RAD_P1  Normally open VPP service pads  [VPP_SERVICE_SMT_D1p5_P2p5]
RAD_R1  ERJ-2GE0R00X  [0402L]
RAD_R2  CRCW04027K50FKED  [0402L]
RAD_R7  CRCW040210K0FKED  [0402L]
RAD_R9  CRCW040210K0FKED  [0402L]
RAD_R13  ERJ-2GE0R00X  [0402L]
RAD_R14  ERJ-2GE0R00X  [0402L]
RAD_R17  ERJ-2GE0R00X  [0402L]
RAD_R26  CRCW040210R2FKED  [0402L]
RAD_R27  ERJ-2GE0R00X  [0402L]
RAD_R29  ERJ-2GE0R00X  [0402L]
RAD_R30  CSNL1206FT1L00  [1206L]
RAD_R32  CRCW040210R2FKED  [0402L]
RAD_R33  ERJ-2GE0R00X  [0402L]
RAD_R35  ERJ-2GE0R00X  [0402L]
RAD_R37  ERJ-2GE0R00X  [0402L]
RAD_R38  CRCW040247K5FKED  [0402L]
RAD_R39  ERJ-1GNF33R2C  [FP-ERJ-1GNF33R2C_0201-MFG]
RAD_R40  ERJ-1GNF33R2C  [FP-ERJ-1GNF33R2C_0201-MFG]
RAD_R41  CRCW040210K0FKED  [0402L]
RAD_R42  ERJ-1GNF33R2C  [FP-ERJ-1GNF33R2C_0201-MFG]
RAD_R43  CRCW040210K0FKED  [0402L]
RAD_R44  ERJ-1GNF33R2C  [FP-ERJ-1GNF33R2C_0201-MFG]
RAD_R45  ERJ-1GNF33R2C  [FP-ERJ-1GNF33R2C_0201-MFG]
RAD_R47  CRCW040210R2FKED  [0402L]
RAD_R49  CRCW040210K0FKED  [0402L]
RAD_R56  CRCW040210R2FKED  [0402L]
RAD_R57  ERJ-2GE0R00X  [0402L]
RAD_R58  ERJ-2GE0R00X  [0402L]
RAD_R59  ERJ-2GE0R00X  [0402L]
RAD_R60  CSNL1206FT1L00  [1206L]
RAD_R62  ERJ-2GE0R00X  [0402L]
RAD_R63  ERJ-2GE0R00X  [0402L]
RAD_R64  CSNL1206FT1L00  [1206L]
RAD_R65  CRCW040210R2FKED  [0402L]
RAD_R66  CRCW040210R2FKED  [0402L]
RAD_R71  ERJ-2GE0R00X  [0402L]
RAD_R73  HCJ0603ZT0R00  [FP-HCJ0603ZT0R00_0603-MFG]
RAD_R75  ERJ-2GE0R00X  [0402L]
RAD_R76  ERJ-2GE0R00X  [0402L]
RAD_R99  CRCW04021K00FKED  [0402L]
RAD_R104  HCJ0603ZT0R00  [FP-HCJ0603ZT0R00_0603-MFG]
RAD_R106  CRCW040210K0FKED  [0402L]
RAD_R111  HCJ0603ZT0R00  [FP-HCJ0603ZT0R00_0603-MFG]
RAD_R116  CRCW04020000Z0EDHP  [0402L]
RAD_R125  CRCW040210K0FKED  [0402L]
RAD_R128  ERJ-2GE0R00X  [0402L]
RAD_R129  ERJ-2GE0R00X  [0402L]
RAD_R186  ERJ-2GE0R00X  [0402L]
RAD_R190  ERJ-2GE0R00X  [0402L]
RAD_R193  CRCW040233R2FKED  [0402L]
RAD_R200  HCJ0603ZT0R00  [FP-HCJ0603ZT0R00_0603-MFG]
RAD_R218  CRCW02010000Z0ED  [0201L]
RAD_R264  CRCW040210K0FKED  [0402L]
RAD_R276  CRCW04022K94FKED  [0402L]
RAD_R277  CRCW04022K94FKED  [0402L]
RAD_R291  ERJ-2GE0R00X  [0402L]
RAD_R292  CRCW04022K20JNED  [0402L]
RAD_R299  CRCW040210K0FKED  [0402L]
RAD_R300  CRCW04027K87FKED  [0402L]
RAD_R301  CRCW040210K0FKED  [0402L]
RAD_R302  CRCW040282K5FKED  [0402L]
RAD_R305  CRCW040210K0FKED  [0402L]
RAD_R307  CRCW040282K5FKED  [0402L]
RAD_R309  CRCW040210K0FKED  [0402L]
RAD_R310  CRCW040210K0FKED  [0402L]
RAD_R311  CRCW04027K87FKED  [0402L]
RAD_R313  CRCW040282K5FKED  [0402L]
RAD_R346  CSNL1206FT1L00  [1206L]
RAD_R348  CRCW040210R2FKED  [0402L]
RAD_R352  CRCW040210R2FKED  [0402L]
RAD_R386  CRCW040233R2FKED  [0402L]
RAD_R409  CRCW040210K0FKED  [0402L]
RAD_TP8  TESTPOINT  [TP_25MIL-SMT]
RAD_U1  GD25B64CWAG  [FP-GD25B64CWAG_WSON8-IPC_C]
RAD_U2  LM63635DQDRRRQ1  [DRR0012E-MFG]
RAD_U8  LP877451A1RXVRQ1  [RXV0028A-MFG]
RAD_U9  INA226AIDGSR  [DGS0010A_L]
RAD_U11  INA226AIDGSR  [DGS0010A_L]
RAD_U12  INA226AIDGSR  [DGS0010A_L]
RAD_U22  INA226AIDGSR  [DGS0010A_L]
RAD_U27  TPS78417QDBVRQ1  [DBV0005A-MFG]
RAD_U29  AWR2944PBGALTRQ1  [ALT0266A-MFG]
RAD_Y3  NX2016SA-50M-STD-CZS-3  [FP-NX2016SA-50M-STD-CZS-3_SMT4_2MM0_1MM6-MFG]
SW1  NRST  [ESwitch_TL3301_GullWing_6x6]
TP1  HOST_UART1_TX  [TestPoint_Pad_D1.0mm]
TP2  HOST_UART1_RX  [TestPoint_Pad_D1.0mm]
TP_RAD_FLASH  Service pad  [TestPoint_Pad_D1.5mm]
TP_RAD_GND  Service pad  [TestPoint_Pad_D1.5mm]
TP_RAD_RESET  Service pad  [TestPoint_Pad_D1.5mm]
TP_RAD_VIO  Service pad  [TestPoint_Pad_D1.5mm]
U1  STM32H753IIT6  [LQFP-176_24x24mm_P0.5mm]
U2  IMU  [ICM-42688-P_LGA14_2.5x3mm_P0.5mm]
U4  CAN_FD  [Texas_DRB0008A]
U5  3V3_BUCK  [VQFN-16-1EP_3x3mm_P0.5mm_EP1.68x1.68mm]
U6  24V_SYS_EFUSE  [Texas_RGE0024C_VQFN-24-1EP_4x4mm_P0.5mm_EP2.1x2.1mm]
U7  RADAR_12V_EFUSE  [TPS259470A_RPW0010A_VQFN-HR-10_2x2mm_P0.475mm]
U8  24V_TO_12V_5A  [Texas_RNP0030B_WQFN-30-1EP_4x6mm_P0.5mm_EP1.8x4.5mm_ThermalVias]
U9  5V_GNSS_BUCK  [VQFN-16-1EP_3x3mm_P0.5mm_EP1.68x1.68mm]
U_CAN_RAD  TCAN3404DRBRQ1  [Texas_DRB0008A]
U_FRAME  SN74LVC1G17DCKR  [DCK0005A_N]
U_USB  CP2102N-A02-GQFN20  [CP2102N_QFN20_3x3_EP_Rev1p5]
Y1  25MHz_OSC  [Oscillator_SMD_ECS_2520MV-xxx-xx-4Pin_2.5x2.0mm]

### Nets
3V3: C2.1 C12.1 C15.1 C20.1 C21.1 C22.1 C40.1 C100.1 C101.1 C102.1 C103.1 C104.1 C105.1 C106.1 C107.1 C108.1 C109.1 C110.1 C111.1 C112.1 C113.1 C114.1 C_FRAME.1 FB1.1 J10.1(Pin_1) L1.2 R5P.2 R6F.2 R7F.2 R70.2 R600.1 R605.1 R803.2 U1.6(VBAT) U1.15(VDD) U1.23(VDD) U1.36(VDD) U1.49(VDD) U1.62(VDD) U1.72(VDD) U1.82(VDD) U1.91(VDD) U1.103(VDD) U1.114(VDD33_USB) U1.127(VDD) U1.136(VDD) U1.149(VDD) U1.159(VDD) U1.171(PDR_ON) U1.172(VDD) U2.5(VDDIO) U2.8(VDD) U4.3(VCC) U5.14(VOS) U_FRAME.5 Y1.4(VDD)
5V_GNSS: C91.1 J8.1(Pin_1) L9.2 R90.2 U9.14(VOS)
BOOT0: R10.1 R70.1 U1.166(BOOT0)
BUCK5_SW: L9.1 U9.1(SW) U9.2(SW) U9.3(SW)
BUCK_SW: L1.1 U5.1(SW) U5.2(SW) U5.3(SW)
CAN_RX: U1.142(PD0) U4.4(RXD)
CAN_TX: U1.143(PD1) U4.1(TXD)
GND: C1.2 C2.2 C3.2 C4.2 C6D.2 C6I.2 C7D.2 C10.2 C11.2 C12.2 C13.2 C14.2 C15.2 C20.2 C21.2 C22.2 C40.2 C90.2 C91.2 C92.2 C93.2 C100.2 C101.2 C102.2 C103.2 C104.2 C105.2 C106.2 C107.2 C108.2 C109.2 C110.2 C111.2 C112.2 C113.2 C114.2 C115.2 C800.2 C801.2 C802.2 C803.2 C804.2 C806.2 C807.2 C808.2 C809.2 C_CAN_RAD.2 C_FRAME.2 C_USB_1U.2 C_USB_4U7.2 C_USB_100N.2 D1.2(A2) D3.3(GND) D3.8(GND) D4.3(GND) D8.3(GND) D8.8(GND) D_USB.3 D_USB.8 J1.2(Pin_2) J6.1(Pin_1) J6.4(Pin_4) J8.6(Pin_6) J10.3(Pin_3) J10.5(Pin_5) JUSB1.5 JUSB1.6 JUSB1.7 JUSB1.8 JUSB1.9 JUSB1.10 JUSB1.11 R1.2 R2.2 R10.2 R41.2 R42.2 R63.2 R73.2 R801.2 R802.2 R805.2 R_CAN_SHDN.2 R_CAN_STB.2 R_FRAME_PD.2 R_USB_CTS.1 R_USB_VBUS_L.2 RAD_C1.1 RAD_C2.1 RAD_C5.1 RAD_C6.1 RAD_C8.1 RAD_C9.2 RAD_C10.2 RAD_C15.2 RAD_C22.1 RAD_C23.2 RAD_C25.2 RAD_C26.2 RAD_C29.2 RAD_C31.2 RAD_C58.2 RAD_C60.2 RAD_C92.1 RAD_C96.1 RAD_C99.2(-) RAD_C100.2 RAD_C101.2 RAD_C102.2 RAD_C103.2 RAD_C104.2 RAD_C105.1 RAD_C106.2 RAD_C107.1 RAD_C108.2 RAD_C110.2 RAD_C111.1 RAD_C112.2 RAD_C113.1 RAD_C114.2 RAD_C115.1 RAD_C116.2 RAD_C117.1 RAD_C118.1 RAD_C119.2 RAD_C125.2 RAD_C126.2 RAD_C129.2 RAD_C130.2 RAD_C132.2 RAD_C134.2 RAD_C137.1 RAD_C138.1 RAD_C139.1 RAD_C140.1 RAD_C141.1 RAD_C142.1 RAD_C143.2 RAD_C144.1 RAD_C145.2 RAD_C146.1 RAD_C149.1 RAD_C150.1 RAD_C153.1 RAD_C163.1 RAD_C164.1 RAD_C165.1 RAD_C168.1 RAD_C170.1 RAD_C172.1 RAD_C173.1 RAD_C174.1 RAD_C175.1 RAD_C176.1 RAD_C177.1 RAD_C179.2 RAD_C180.2 RAD_C181.2 RAD_C195.2 RAD_C199.2 RAD_C200.2 RAD_C201.2 RAD_C202.2 RAD_NT1.1 RAD_NT2.2 RAD_NT3.2 RAD_NT4.2 RAD_R1.2 RAD_R2.1 RAD_R292.1 RAD_R302.1 RAD_R307.1 RAD_R313.1 RAD_U1.4(VSS) RAD_U1.9(EP) RAD_U2.9(AGND) RAD_U2.13(PGND/DAP) RAD_U8.12(PGND_B3BST) RAD_U8.26(PGND_B12) RAD_U9.1(A1) RAD_U9.2(A0) RAD_U9.7(GND) RAD_U11.1(A1) RAD_U11.7(GND) RAD_U12.2(A0) RAD_U12.7(GND) RAD_U22.1(A1) RAD_U22.7(GND) RAD_U27.2(GND) RAD_U29.A1(VSSA) RAD_U29.A2(VSSA) RAD_U29.A4(VSSA) RAD_U29.A6(VSSA) RAD_U29.A8(VSSA) RAD_U29.A10(VSSA) RAD_U29.A12(VSS) RAD_U29.A18(VSS) RAD_U29.B2(VSSA) RAD_U29.B4(VSSA) RAD_U29.B6(VSSA) RAD_U29.B8(VSSA) RAD_U29.B10(VSSA) RAD_U29.C1(VSSA) RAD_U29.C2(VSSA) RAD_U29.C3(VSSA) RAD_U29.C4(VSSA) RAD_U29.C5(VSSA) RAD_U29.C6(VSSA) RAD_U29.C7(VSSA) RAD_U29.C8(VSSA) RAD_U29.C9(VSSA) RAD_U29.C10(VSSA) RAD_U29.D2(VSSA) RAD_U29.D3(VSSA) RAD_U29.E1(VSSA) RAD_U29.E2(VSSA) RAD_U29.E3(VSSA) RAD_U29.E11(VSS) RAD_U29.E18(VSS) RAD_U29.F3(VSSA) RAD_U29.F6(VSSA) RAD_U29.F7(VSSA) RAD_U29.F8(VSS) RAD_U29.F9(VSS) RAD_U29.F10(VSS) RAD_U29.F11(VSS) RAD_U29.F12(VSS) RAD_U29.F13(VSS) RAD_U29.G1(VSSA) RAD_U29.G2(VSSA) RAD_U29.G3(VSSA) RAD_U29.G6(VSSA) RAD_U29.G7(VSS) RAD_U29.G8(VSS) RAD_U29.G9(VSS) RAD_U29.G10(VSS) RAD_U29.G11(VSS) RAD_U29.G12(VSS) RAD_U29.G13(VSS) RAD_U29.G14(VSS) RAD_U29.H3(VSSA) RAD_U29.H6(VSSA) RAD_U29.H7(VSS) RAD_U29.H8(VSS) RAD_U29.H9(VSS) RAD_U29.H10(VSS) RAD_U29.H11(VSS) RAD_U29.H12(VSS) RAD_U29.H13(VSS) RAD_U29.J1(VSSA) RAD_U29.J2(VSSA) RAD_U29.J3(VSSA) RAD_U29.J6(VSSA) RAD_U29.J7(VSS) RAD_U29.J8(VSS) RAD_U29.J9(VSS) RAD_U29.J10(VSS) RAD_U29.J11(VSS) RAD_U29.J12(VSS) RAD_U29.J13(VSS) RAD_U29.K3(VSSA) RAD_U29.K6(VSSA) RAD_U29.K7(VSS) RAD_U29.K8(VSS) RAD_U29.K9(VSS) RAD_U29.K10(VSS) RAD_U29.K11(VSS) RAD_U29.K12(VSS) RAD_U29.K13(VSS) RAD_U29.K16(VSS) RAD_U29.L1(VSSA) RAD_U29.L2(VSSA) RAD_U29.L3(VSSA) RAD_U29.L6(VSSA) RAD_U29.L7(VSS) RAD_U29.L8(VSS) RAD_U29.L9(VSS) RAD_U29.L10(VSS) RAD_U29.L11(VSS) RAD_U29.L12(VSS) RAD_U29.L13(VSS) RAD_U29.M3(VSSA) RAD_U29.M6(VSSA) RAD_U29.M7(VSS) RAD_U29.M8(VSS) RAD_U29.M9(VSS) RAD_U29.M10(VSS) RAD_U29.M11(VSS) RAD_U29.M12(VSS) RAD_U29.M13(VSS) RAD_U29.M14(VSS) RAD_U29.N1(VSSA) RAD_U29.N2(VSSA) RAD_U29.N3(VSSA) RAD_U29.N7(VSS) RAD_U29.N8(VSS) RAD_U29.N9(VSS) RAD_U29.N10(VSS) RAD_U29.N11(VSS) RAD_U29.N12(VSS) RAD_U29.N13(VSS) RAD_U29.P8(VSS) RAD_U29.P12(VSS) RAD_U29.P18(VSS) RAD_U29.V1(VSSA) RAD_U29.V2(VSS) RAD_U29.V9(VSS) RAD_U29.V14(VSS) RAD_U29.V18(VSS) RAD_Y3.2(GND) RAD_Y3.4(GND) SW1.2 TP_RAD_GND.1 U1.14(VSS) U1.22(VSS) U1.37(VSSA) U1.48(VSS) U1.61(VSS) U1.71(VSS) U1.90(VSS) U1.102(VSS) U1.113(VSS) U1.126(VSS) U1.135(VSS) U1.148(VSS) U1.158(VSS) U2.6(GND) U2.7(RESV) U2.9(INT2/FSYNC/CLKIN) U4.2(GND) U4.9(THERMAL_PAD) U5.5(FB) U5.6(AGND) U5.15(PGND) U5.16(PGND) U5.17(THERMAL_PAD) U6.8(GND) U6.11(MODE) U6.25(THERMAL_PAD) U7.8(GND) U8.7(NC) U8.13(AGND) U8.14(AGND) U8.15(AGND) U8.17(SYNC/MODE) U8.19(NC_THERMAL) U8.23(NC) U8.24(PGND) U8.25(PGND) U8.26(PGND) U8.27(NC_THERMAL) U8.28(NC_THERMAL) U8.29(NC_THERMAL) U8.30(NC_THERMAL) U8.31(THERMAL_PAD) U9.5(FB) U9.6(AGND) U9.15(PGND) U9.16(PGND) U9.17(THERMAL_PAD) U_CAN_RAD.2 U_CAN_RAD.9 U_FRAME.3 U_USB.3(GND) U_USB.12(GND) U_USB.21(EP_GND) Y1.2(GND)
GNSS_PPS: D8.4(D2+) J8.4(Pin_4) U1.40(PA0)
GNSS_RX_EXT: D8.1(D1+) J8.2(Pin_2) U1.96(PD8)
GNSS_TX_EXT: D8.2(D1-) J8.3(Pin_3) U1.97(PD9)
HOST_UART1_RX: R600.2 R602.2 TP2.1 U1.150(PD6)
HOST_UART1_RX_EXT: D3.2(D1-) J6.3(Pin_3) R602.1
HOST_UART1_TX: R601.2 TP1.1 U1.147(PD5)
HOST_UART1_TX_EXT: D3.1(D1+) J6.2(Pin_2) R601.1
HOST_UART2_RX: R604.2 R605.2 U1.121(PA10)
HOST_UART2_RX_EXT: D3.5(D2-) J6.6(Pin_6) R604.1
HOST_UART2_TX: R603.2 U1.120(PA9)
HOST_UART2_TX_EXT: D3.4(D2+) J6.5(Pin_5) R603.1
IMU_DRDY: U1.80(PB11) U2.4(INT1/INT)
IMU_MISO: U1.94(PB14) U2.1(AP_SDO/AP_AD0)
IMU_MOSI: U1.95(PB15) U2.14(AP_SDA/AP_SDIO/AP_SDI)
IMU_NSS: U1.92(PB12) U2.12(AP_CS)
IMU_SCK: U1.93(PB13) U2.13(AP_SCL/AP_SCLK)
MCU_HSE_25M: U1.29(PH0) Y1.3(OUT)
NRST: C115.1 SW1.1 U1.31(NRST)
RAD_CAN_SHDN: R_CAN_SHDN.1 U_CAN_RAD.5
RAD_CAN_STB: R_CAN_STB.1 U_CAN_RAD.8
RAD_FRAME_RAW: R_FRAME_PD.1 RAD_U29.G15(MSS_GPIO_2) U_FRAME.2
RADAR_12V: RAD_C99.1(+) RAD_C101.1 RAD_C118.2 RAD_C173.2 RAD_C195.1 RAD_L5.2 RAD_R7.1 RAD_U2.12(VIN) U7.6(OUT)
RADAR_CANH: D4.1(IO1) R40.1 R_CAN_TERM.1 U4.7(CANH) U_CAN_RAD.7
RADAR_CANL: D4.2(IO2) R40.2 R_CAN_TERM.2 U4.6(CANL) U_CAN_RAD.6
RADAR_EFUSE_FLT: R7F.1 U1.2(PE3) U7.4(FLT)
RADAR_REF: U1.79(PB10) U_FRAME.4
SHDN_PD: R42.1 U4.5(SHDN)
STB_PD: R41.1 U4.8(STB)
SWCLK: J10.4(Pin_4) U1.137(PA14)
SWDIO: J10.2(Pin_2) U1.124(PA13)
SWO: J10.6(Pin_6) U1.161(PB3)
SYS_EFUSE_FLT: R6F.1 U1.1(PE2) U6.14(FLT)
TI_1V0: RAD_C114.1 RAD_C115.2 RAD_C116.1 RAD_C117.2 RAD_C179.1 RAD_C179.3 RAD_C181.1 RAD_C181.3 RAD_R56.1 RAD_R64.2 RAD_U22.8(VBUS) RAD_U29.D6(VDDA_10RF2) RAD_U29.D7(VDDA_10RF2) RAD_U29.M4(VDDA_10RF1)
TI_1V0_FILTERED: RAD_R64.1 RAD_R66.1 RAD_R73.2 RAD_R111.2
TI_1V2: RAD_C92.2 RAD_C96.2 RAD_C137.2 RAD_C138.2 RAD_C139.2 RAD_C140.2 RAD_C141.2 RAD_C142.2 RAD_C146.2 RAD_R26.1 RAD_R30.2 RAD_U9.8(VBUS) RAD_U29.E12(VDD) RAD_U29.E13(VDD) RAD_U29.E14(VDD) RAD_U29.F14(VDD) RAD_U29.H14(VDD) RAD_U29.J14(VDD) RAD_U29.K14(VDD) RAD_U29.L14(VDD) RAD_U29.N6(VDD) RAD_U29.N14(VDD) RAD_U29.P6(VDD) RAD_U29.P7(VDD) RAD_U29.P9(VDD) RAD_U29.P10(VDD) RAD_U29.P11(VDD) RAD_U29.P13(VDD) RAD_U29.P14(VDD) RAD_U29.V7(VDD_SRAM) RAD_U29.V13(VNWA)
TI_1V4_APLL: RAD_C103.1 RAD_U29.H4(VOUT_14APLL)
TI_1V4_SYNTH: RAD_C102.1 RAD_U29.G4(VOUT_14SYNTH)
TI_1V8: RAD_C5.2 RAD_C107.2 RAD_C110.1 RAD_C111.2 RAD_C112.1 RAD_C113.2 RAD_C163.2 RAD_C164.2 RAD_C165.2 RAD_C168.2 RAD_C170.2 RAD_C172.2 RAD_R47.1 RAD_R60.2 RAD_U11.8(VBUS) RAD_U29.D9(VDDA_18CLK) RAD_U29.D18(VIOIN_18) RAD_U29.E4(VDDA_18VCO) RAD_U29.K17(VIOIN_18LVDS) RAD_U29.K18(VIOIN_18CSI) RAD_U29.P1(VDDA_18BB) RAD_U29.R1(VDDA_18PM) RAD_U29.U18(VIOIN_18) RAD_U29.V10(VIOIN_18)
TI_1V8_FILTERED: RAD_R60.1 RAD_R65.1 RAD_R104.2
TI_3V3: RAD_C174.2 RAD_C175.2 RAD_C176.2 RAD_C177.2 RAD_R346.2 RAD_R348.1 RAD_U12.8(VBUS) RAD_U29.A13(VIOIN) RAD_U29.B18(VIOIN) RAD_U29.R18(VIOIN) RAD_U29.V8(VIOIN) RAD_U29.V15(VIOIN)
TI_3V3_VIO: C_CAN_RAD.1 C_USB_1U.1 C_USB_4U7.1 C_USB_100N.1 R_USB_RESET.1 R_USB_WAKE.1 RAD_R37.1 RAD_R38.2 RAD_R41.2 RAD_R43.2 RAD_R49.2 RAD_R106.2 RAD_R116.2 RAD_R264.2 RAD_R276.2 RAD_R277.2 RAD_R301.2 RAD_R309.2 RAD_R311.2 RAD_R346.1 RAD_R352.1 RAD_R409.2 TP_RAD_VIO.1 U_CAN_RAD.3 U_USB.6(VDD) U_USB.7(VREGIN)
TI_3V3REG_ENA: RAD_R7.2 RAD_U2.10(EN)
TI_3V3REG_MODE: RAD_R9.1 RAD_U2.6(SYNC/MODE)
TI_3V3REG_VCC: RAD_C10.1 RAD_R9.2 RAD_U2.3(VCC)
TI_5V0: RAD_C119.1 RAD_U8.10(VOUT_BST)
TI_+3.3VD: RAD_C124.2 RAD_R116.1 RAD_U8.9(VIO_LDO)
TI_AGND: RAD_C3.1 RAD_C123.1 RAD_C124.1 RAD_NT1.2 RAD_NT2.1 RAD_NT3.1 RAD_NT4.1 RAD_U8.5(AGND) RAD_U8.5-19 RAD_U8.19(AGND)
TI_AR_NERROUT: RAD_R76.1 RAD_U29.C11(~{ERROR_OUT})
TI_AR_NRST: RAD_C105.2 RAD_R99.1 RAD_R264.1 RAD_U29.H16(~{RESET}) TP_RAD_RESET.1
TI_AR_WRMRST: RAD_U29.B12(WARM_RESET)
TI_BSS_UARTA_TX: RAD_U29.M16(BSS_UARTA_TX)
TI_CANA_NSTB: RAD_R13.1
TI_CANB_NSTB: RAD_R17.1
TI_CSI2_RX0_0_N: RAD_U29.N18(CSI2_RX0M0)
TI_CSI2_RX0_0_P: RAD_U29.N17(CSI2_RX0P0)
TI_CSI2_RX0_1_N: RAD_U29.M18(CSI2_RX0M1)
TI_CSI2_RX0_1_P: RAD_U29.M17(CSI2_RX0P1)
TI_CSI2_RX0_CLK_N: RAD_U29.L18(CSI2_RX0CLKM)
TI_CSI2_RX0_CLK_P: RAD_U29.L17(CSI2_RX0CLKP)
TI_DSS_UARTA_RX: RAD_U29.B14(DSS_UARTA_RX)
TI_DSS_UARTA_TX: RAD_U29.A15(DSS_UARTA_TX)
TI_FB_B1: RAD_R14.1 RAD_U8.3(FB_B1)
TI_FB_B2: RAD_R71.1 RAD_U8.21(FB_B2)
TI_FB_B3: RAD_R291.1 RAD_U8.17(FB_B3)
TI_GPADC1: RAD_U29.P3(ADC1)
TI_GPADC2: RAD_U29.P2(ADC2)
TI_GPADC3: RAD_U29.R3(ADC3)
TI_GPADC4: RAD_U29.R2(ADC4)
TI_GPADC5: RAD_U29.T3(ADC5)
TI_GPADC6: RAD_U29.U2(ADC6)
TI_GPADC7: RAD_U29.T1(ADC7)
TI_GPADC8: RAD_U29.T2(ADC8)
TI_GPADC9: RAD_U29.U1(ADC9)
TI_GPIO_3: RAD_U29.P16(MSS_GPIO_3)
TI_GPIO_4: RAD_U29.L15(MSS_GPIO_4)
TI_GPIO_8: RAD_U29.T18(MSS_GPIO_8)
TI_GPIO_9: RAD_U29.N15(MSS_GPIO_9)
TI_GPIO_30: RAD_U29.P17(MSS_GPIO_30)
TI_GPIO_31: RAD_U29.U17(MSS_GPIO_31)
TI_LVDS_TX0_N: RAD_U29.F18(LVDS_TXM0)
TI_LVDS_TX0_P: RAD_U29.F17(LVDS_TXP0)
TI_LVDS_TX1_N: RAD_U29.J18(LVDS_TXM1)
TI_LVDS_TX1_P: RAD_U29.J17(LVDS_TXP1)
TI_LVDS_TX2_CLK_N: RAD_U29.G18(LVDS_TXM2_CLKM)
TI_LVDS_TX2_CLK_P: RAD_U29.G17(LVDS_TXP2_CLKP)
TI_LVDS_TX3_FRCLK_N: RAD_U29.H18(LVDS_TXM3_FRCLKM)
TI_LVDS_TX3_FRCLK_P: RAD_U29.H17(LVDS_TXP3_FRCLKP)
TI_MCU_CLK_OUT: RAD_U29.R15(MCU_CLKOUT)
TI_MSS_EPWMA0: RAD_U29.E15(MSS_EPWMA0)
TI_MSS_EPWMA1: RAD_U29.C18(MSS_EPWMA1)
TI_MSS_EPWMB0: RAD_U29.C17(MSS_EPWMB0)
TI_MSS_GPIO_0: RAD_U29.B15(MSS_GPIO_0)
TI_MSS_GPIO_1: RAD_U29.A16(MSS_GPIO_1)
TI_MSS_GPIO_11: RAD_U29.J15(MSS_GPIO_11)
TI_MSS_GPIO_28: RAD_U29.R17(MSS_GPIO_28)
TI_MSS_I2CA_SCL: RAD_R27.2 RAD_R33.2 RAD_R57.2 RAD_R58.2 RAD_R276.1 RAD_U29.U9(MSS_I2CA_SCL)
TI_MSS_I2CA_SDA: RAD_R29.2 RAD_R35.2 RAD_R59.2 RAD_R62.2 RAD_R277.1 RAD_U29.R8(MSS_I2CA_SDA)
TI_MSS_MCANA_RX: RAD_U29.D16(MSS_MCANA_RX) U_CAN_RAD.4
TI_MSS_MCANA_TX: RAD_U29.D17(MSS_MCANA_TX) U_CAN_RAD.1
TI_MSS_MCANB_RX: RAD_U29.A17(MSS_MCANB_RX)
TI_MSS_MCANB_TX: RAD_U29.B17(MSS_MCANB_TX)
TI_MSS_MDIO_CLK: RAD_U29.R4(MSS_MDIO_CLK)
TI_MSS_MDIO_DATA: RAD_U29.T5(MSS_MDIO_DATA)
TI_MSS_RGMII_RCLK: RAD_U29.T9(MSS_RGMII_RCLK)
TI_MSS_RGMII_RCTL: RAD_U29.T7(MSS_RGMII_RCTL)
TI_MSS_RGMII_RD0: RAD_U29.V6(MSS_RGMII_RD0)
TI_MSS_RGMII_RD1: RAD_U29.V4(MSS_RGMII_RD1)
TI_MSS_RGMII_RD2: RAD_U29.V5(MSS_RGMII_RD2)
TI_MSS_RGMII_RD3: RAD_U29.U10(MSS_RGMII_RD3)
TI_MSS_RGMII_TCLK: RAD_U29.V3(MSS_RGMII_TCLK)
TI_MSS_RGMII_TCTL: RAD_U29.R6(MSS_RGMII_TCTL)
TI_MSS_RGMII_TD0: RAD_U29.U7(MSS_RGMII_TD0)
TI_MSS_RGMII_TD1: RAD_U29.U5(MSS_RGMII_TD1)
TI_MSS_RGMII_TD2: RAD_U29.U6(MSS_RGMII_TD2)
TI_MSS_RGMII_TD3: RAD_U29.U4(MSS_RGMII_TD3)
TI_MSS_RS232RX: RAD_U29.F16(MSS_RS232_RX)
TI_MSS_RS232TX: RAD_U29.E17(MSS_RS232_TX)
TI_MSS_SPIA_CLK: RAD_U29.T16(MSS_MIBSPIA_CLK)
TI_MSS_SPIA_CS0: RAD_U29.T15(MSS_MIBSPIA_CS0)
TI_MSS_SPIA_HOSTIRQ: RAD_U29.V17(MSS_MIBSPIA_HOSTIRQ)
TI_MSS_SPIA_MOSI: RAD_U29.U15(MSS_MIBSPIA_MOSI)
TI_MSS_SPIB_CS1: RAD_U29.V16(MSS_MIBSPIB_CS1)
TI_MSS_UARTA_RX: RAD_R129.1 RAD_U29.B16(MSS_UARTA_RX)
TI_NERR_MCU: RAD_R76.2 RAD_U8.16(~{ERR}/GPO2)
TI_NetC1_2: RAD_C1.2 RAD_C2.2 RAD_R37.2 RAD_U1.8(VCC)
TI_NetC14_1: RAD_C14.1 RAD_R26.2 RAD_U9.9(VIN-)
TI_NetC14_2: RAD_C14.2 RAD_R32.2 RAD_U9.10(VIN+)
TI_NetC17_1: RAD_C17.1 RAD_R47.2 RAD_U11.9(VIN-)
TI_NetC17_2: RAD_C17.2 RAD_R65.2 RAD_U11.10(VIN+)
TI_NetC19_1: RAD_C19.1 RAD_R348.2 RAD_U12.9(VIN-)
TI_NetC19_2: RAD_C19.2 RAD_R352.2 RAD_U12.10(VIN+)
TI_NetC21_1: RAD_C21.1 RAD_U2.2(BOOT)
TI_NetC21_2: RAD_C21.2 RAD_L6.1 RAD_U2.1(SW)
TI_NetC81_1: RAD_C81.1 RAD_R56.2 RAD_U22.9(VIN-)
TI_NetC81_2: RAD_C81.2 RAD_R66.2 RAD_U22.10(VIN+)
TI_NetC100_1: RAD_C100.1 RAD_L5.1
TI_NetC104_1: RAD_C104.1 RAD_C126.1
TI_NetC123_2: RAD_C123.2 RAD_U8.18(VOUT_VLDO)
TI_NetC149_2: RAD_C149.2 RAD_P1.2 RAD_U27.5(OUT)
TI_NetJ17_1: RAD_R300.2 TP_RAD_FLASH.1
TI_NetL1_1: RAD_L1.1 RAD_U8.11(SW_BST)
TI_NetR1_1: RAD_R1.1 RAD_U2.5(VSEL)
TI_NetR2_2: RAD_R2.2 RAD_U2.4(RT)
TI_NetR27_1: RAD_R27.1 RAD_U9.5(SCL)
TI_NetR29_1: RAD_R29.1 RAD_U9.4(SDA)
TI_NetR33_1: RAD_R33.1 RAD_U11.5(SCL)
TI_NetR35_1: RAD_R35.1 RAD_U11.4(SDA)
TI_NetR57_1: RAD_R57.1 RAD_U22.5(SCL)
TI_NetR58_1: RAD_R58.1 RAD_U12.5(SCL)
TI_NetR59_1: RAD_R59.1 RAD_U12.4(SDA)
TI_NetR62_1: RAD_R62.1 RAD_U22.2(A0) RAD_U22.4(SDA)
TI_NetR63_1: RAD_R63.1 RAD_U8.1(SCK_SPI)
TI_NetR159_2: RAD_R409.1 RAD_U27.3(EN)
TI_NetR186_1: RAD_R186.1 RAD_U8.8(SDI_SPI)
TI_NetR190_2: RAD_R190.2 RAD_R292.2 RAD_U8.4(CS_SPI/WD_DIS)
TI_NetR193_1: RAD_R193.1 RAD_U8.2(SDO_SPI)
TI_NetR298_1: RAD_R299.2 RAD_R300.1 RAD_R302.2
TI_NetR304_1: RAD_R305.2 RAD_R307.2
TI_NetR308_1: RAD_R310.2 RAD_R311.1 RAD_R313.2
TI_NetR386_2: RAD_R386.2 RAD_U29.D15(TDO)
TI_NetR392_2: RAD_U29.U16(MSS_MIBSPIA_MISO)
TI_NetTP8_1: RAD_TP8.1 RAD_U8.22(VMON1/GPO1)
TI_NRSTOUT: RAD_R99.2 RAD_U8.6(~{RSTOUT})
TI_OSC_CLK_OUT_ETHERNET: RAD_U29.B11(OSC_CLK_OUT_ETH)
TI_OSC_CLKTOP: RAD_U29.A11(OSC_CLKOUT)
TI_PMIC_CLK_OUT: RAD_R218.1 RAD_U29.T17(PMIC_CLKOUT)
TI_PMIC_EN: RAD_R125.1 RAD_U8.15(ENABLE)
TI_PMIC_NINT: RAD_R13.2 RAD_R17.2 RAD_R106.1 RAD_U8.7(~{INT})
TI_PMIC_SPI_CLK: RAD_R63.2 RAD_U29.T13(MSS_MIBSPIB_CLK)
TI_PMIC_SPI_CS0: RAD_R190.1 RAD_U29.U14(MSS_MIBSPIB_CS0)
TI_PMIC_SPI_MISO: RAD_R193.2 RAD_U29.U13(MSS_MIBSPIB_MISO)
TI_PMIC_SPI_MOSI: RAD_R186.2 RAD_U29.V12(MSS_MIBSPIB_MOSI)
TI_PMICOUT_1V0: RAD_C132.1 RAD_C134.1 RAD_L8.2 RAD_R71.2 RAD_R73.1 RAD_R111.1
TI_PMICOUT_1V2: RAD_C129.1 RAD_C130.1 RAD_L2.2 RAD_R30.1 RAD_R32.1 RAD_R291.2
TI_PMICOUT_1V8: RAD_C60.1 RAD_C125.1 RAD_L9.2 RAD_R14.2 RAD_R104.1
TI_PVIN3V3: RAD_C3.2 RAD_C6.2 RAD_C8.2 RAD_C9.1 RAD_C9.3 RAD_C15.1 RAD_C31.1 RAD_C58.1 RAD_C58.3 RAD_C143.1 RAD_C144.2 RAD_C153.2 RAD_C199.1 RAD_C200.1 RAD_C201.1 RAD_C202.1 RAD_L1.2 RAD_R125.2 RAD_R200.2 RAD_U8.13(PVIN_B3) RAD_U8.20(VCCA) RAD_U8.25(PVIN_B2) RAD_U8.27(PVIN_B1)
TI_QSPI_CS: RAD_R38.1 RAD_U1.1(~{CS}) RAD_U29.U12(MSS_QSPI_CS)
TI_QSPI_D0: RAD_R45.2 RAD_U29.U11(MSS_QSPI_0)
TI_QSPI_D0_FLASH: RAD_R45.1 RAD_U1.5(SI(IO2))
TI_QSPI_D1: RAD_R39.1 RAD_R49.1 RAD_U29.V11(MSS_QSPI_1)
TI_QSPI_D1_FLASH: RAD_R39.2 RAD_U1.2(SO(IO1))
TI_QSPI_D2: RAD_R42.1 RAD_R43.1 RAD_U29.T11(MSS_QSPI_2)
TI_QSPI_D2_FLASH: RAD_R42.2 RAD_U1.3(IO2)
TI_QSPI_D3: RAD_R40.2 RAD_R41.1 RAD_U29.R12(MSS_QSPI_3)
TI_QSPI_D3_FLASH: RAD_R40.1 RAD_U1.7(IO3)
TI_QSPI_SCLK: RAD_R44.2 RAD_U29.R10(MSS_QSPI_CLK)
TI_QSPI_SCLK_FLASH: RAD_R44.1 RAD_U1.6(SCLK)
TI_REGOUT_3V3: RAD_C22.2 RAD_C23.1 RAD_C25.1 RAD_C26.1 RAD_C29.1 RAD_C145.1 RAD_L6.2 RAD_R200.1 RAD_U2.8(FB) RAD_U9.6(VS+) RAD_U11.2(A0) RAD_U11.6(VS+) RAD_U12.1(A1) RAD_U12.6(VS+) RAD_U22.6(VS+) RAD_U27.1(IN)
TI_RX1: RAD_U29.M2(RX1)
TI_RX2: RAD_U29.K2(RX2)
TI_RX3: RAD_U29.H2(RX3)
TI_RX4: RAD_U29.F2(RX4)
TI_SOP0_TDO: RAD_R310.1 RAD_R386.1
TI_SOP1_MSS_SPIB_CS2: RAD_R305.1 RAD_U29.R14(MSS_MIBSPIB_CS2)
TI_SOP2_PMIC_CLK: RAD_R75.1 RAD_R218.2 RAD_R299.1
TI_SOP3_MSS_UARTB_TX: RAD_R301.1 RAD_U29.A14(MSS_UARTB_TX)
TI_SOP4_MSS_UARTA_TX: RAD_R128.1 RAD_R309.1 RAD_U29.C16(MSS_UARTA_TX)
TI_SW_B1: RAD_L9.1 RAD_U8.28(SW_B1)
TI_SW_B2: RAD_L8.1 RAD_U8.24(SW_B2)
TI_SW_B3: RAD_L2.1 RAD_U8.14(SW_B3)
TI_SYNCCLKIN: RAD_R75.2 RAD_U8.23(SYNCCLKIN)
TI_TCK: RAD_U29.C12(TCK)
TI_TDI: RAD_U29.D13(TDI)
TI_TMS: RAD_U29.C14(TMS)
TI_TX1: RAD_U29.B3(TX1)
TI_TX2: RAD_U29.B5(TX2)
TI_TX3: RAD_U29.B7(TX3)
TI_TX4: RAD_U29.B9(TX4)
TI_VBGAP: RAD_C180.1 RAD_U29.K4(VBGAP)
TI_VPP_1P7: RAD_C150.2 RAD_P1.1 RAD_U29.U3(VPP)
TI_VPP_EN: RAD_U29.U8(MSS_GPIO_17)
TI_XDSET_UARTA_RX: RAD_R129.2 U_USB.18(TXD)
TI_XDSET_UARTA_TX: RAD_R128.2 U_USB.17(RXD)
TI_XREF_CLK0: RAD_U29.B13(XREF_CLK0)
TI_XREF_CLK1: RAD_U29.D11(XREF_CLK1)
TI_XTALM: RAD_C108.1 RAD_U29.B1(CLKM) RAD_Y3.3(2_XTAL)
TI_XTALP: RAD_C106.1 RAD_U29.D1(CLKP) RAD_Y3.1(1_XTAL)
U5_PG: R5P.1 U5.4(PG)
U5_SS_LOCAL: C3.1 U5.9(SS/TR)
U6_BGATE: Q6.4(G) Q7.3(D) U6.3(B_GATE)
U6_DRV: Q7.1(G) U6.4(DRV)
U6_DVDT: C6D.1 U6.9(dVdT)
U6_ILIM_LOCAL: R1.1 U6.10(ILIM)
U6_IN_BLOCKED: Q6.5(D) U6.1(IN) U6.2(IN)
U6_OVP_LOCAL: R62.2 R63.1 U6.7(OVP)
U6_PGTH_LOCAL: R804.2 R805.1 U6.15(PGTH)
U6_UVLO_LOCAL: R61.2 R62.1 U6.6(UVLO)
U7_DVDT: C7D.1 U7.7(DVDT)
U7_ILIM_LOCAL: R2.1 U7.9(ILM)
U7_OVLO_LOCAL: R72.2 R73.1 U7.2(OVLO)
U7_UVLO_LOCAL: R71.2 R72.1 U7.1(EN/UVLO)
U8_BOOT: C805.1 U8.6(BOOT)
U8_ENABLE: R806.1 U6.16(PGOOD) U8.18(EN)
U8_FB_LOCAL: R800.2 R801.1 U8.12(FB)
U8_PGOOD: R803.1 U8.16(PGOOD)
U8_RT_LOCAL: R802.1 U8.10(RT)
U8_SW: C805.2 L8.1 U8.1(SW) U8.2(SW) U8.3(SW) U8.4(SW) U8.5(SW)
U8_VCC: C803.1 U8.8(VCC)
U9_PG: R90.1 U9.4(PG)
U9_SS_LOCAL: C92.1 U9.9(SS/TR)
USB_BRIDGE_RESET_N: R_USB_RESET.2 U_USB.9(RESET_N)
USB_CTS_N: R_USB_CTS.2 U_USB.15(CTS)
USB_DM: D_USB.2 JUSB1.2 U_USB.5(D-)
USB_DP: D_USB.1 JUSB1.3 U_USB.4(D+)
USB_VBUS: D_USB.4 JUSB1.1 R_USB_VBUS_H.1
USB_VBUS_SENSE: R_USB_VBUS_H.2 R_USB_VBUS_L.1 U_USB.8(VBUS_SENSE)
USB_WAKE_N: R_USB_WAKE.2 U_USB.13(WAKEUP)
V12_SYS: C1.1 C4.1 C90.1 C93.1 C804.1 C806.1 C807.1 C808.1 C809.1 L8.2 R71.1 R800.1 U5.10(AVIN) U5.11(PVIN) U5.12(PVIN) U5.13(EN) U7.5(IN) U8.9(BIAS) U9.10(AVIN) U9.11(PVIN) U9.12(PVIN) U9.13(EN)
VCAP1_LOCAL: C10.1 U1.81(VCAP)
VCAP2_LOCAL: C11.1 U1.125(VCAP)
VDDA_FILTERED: C13.1 C14.1 FB1.2 U1.38(VREF+) U1.39(VDDA)
VIN_PROTECTED_24V: C800.1 C801.1 C802.1 R804.1 R806.2 U6.17(OUT) U6.18(OUT) U8.20(PVIN) U8.21(PVIN) U8.22(PVIN)
VIN_RAW: C6I.1 D1.1(A1) J1.1(Pin_1) Q6.1(S) Q6.2(S) Q6.3(S) Q7.2(S) R61.1 U6.5(IN_SYS)

Not connected (* = marked no-connect by the designer): D3 6(NC)* 7(NC)* 9(NC)* 10(NC)*; D8 5(D2-)* 6(NC)* 7(NC)* 9(NC)* 10(NC)*; D_USB 5* 6* 7* 9* 10*; J1 Un1*; J6 Un1*; J8 5(Pin_5)* MP*; J10 Un1* Un2* Un3*; JUSB1 4*; RAD_U2 7(~{RESET})* 11(NC)*; RAD_U9 3(ALERT)*; RAD_U11 3(ALERT)*; RAD_U12 3(ALERT)*; RAD_U22 3(ALERT)*; RAD_U27 4(NC)*; U1 3(PE4)* 4(PE5)* 5(PE6)* 7(PI8)* 8(PC13)* 9(PC14)* 10(PC15)* 11(PI9)* 12(PI10)* 13(PI11)* 16(PF0)* 17(PF1)* 18(PF2)* 19(PF3)* 20(PF4)* 21(PF5)* 24(PF6)* 25(PF7)* 26(PF8)* 27(PF9)* 28(PF10)* 30(PH1)* 32(PC0)* 33(PC1)* 34(PC2_C)* 35(PC3_C)* 41(PA1)* 42(PA2)* 43(PH2)* 44(PH3)* 45(PH4)* 46(PH5)* 47(PA3)* 50(PA4)* 51(PA5)* 52(PA6)* 53(PA7)* 54(PC4)* 55(PC5)* 56(PB0)* 57(PB1)* 58(PB2)* 59(PF11)* 60(PF12)* 63(PF13)* 64(PF14)* 65(PF15)* 66(PG0)* 67(PG1)* 68(PE7)* 69(PE8)* 70(PE9)* 73(PE10)* 74(PE11)* 75(PE12)* 76(PE13)* 77(PE14)* 78(PE15)* 83(PH6)* 84(PH7)* 85(PH8)* 86(PH9)* 87(PH10)* 88(PH11)* 89(PH12)* 98(PD10)* 99(PD11)* 100(PD12)* 101(PD13)* 104(PD14)* 105(PD15)* 106(PG2)* 107(PG3)* 108(PG4)* 109(PG5)* 110(PG6)* 111(PG7)* 112(PG8)* 115(PC6)* 116(PC7)* 117(PC8)* 118(PC9)* 119(PA8)* 122(PA11)* 123(PA12)* 128(PH13)* 129(PH14)* 130(PH15)* 131(PI0)* 132(PI1)* 133(PI2)* 134(PI3)* 138(PA15)* 139(PC10)* 140(PC11)* 141(PC12)* 144(PD2)* 145(PD3)* 146(PD4)* 151(PD7)* 152(PG9)* 153(PG10)* 154(PG11)* 155(PG12)* 156(PG13)* 157(PG14)* 160(PG15)* 162(PB4)* 163(PB5)* 164(PB6)* 165(PB7)* 167(PB8)* 168(PB9)* 169(PE0)* 170(PE1)* 173(PI4)* 174(PI5)* 175(PI6)* 176(PI7)*; U2 2(RESV)* 3(RESV)* 10(RESV)* 11(RESV)*; U5 7(FSW)* 8(DEF)*; U6 12(SHDN)* 13(IMON)* 19(NC)* 20(NC)* 21(NC)* 22(NC)* 23(NC)* 24(NC)*; U7 3(AUXOFF)* 10(ITIMER)*; U8 11(SS/TRK)*; U9 7(FSW)* 8(DEF)*; U_FRAME 1*; U_USB 1(GPIO1)* 2(GPIO0)* 10(NC)* 11(SUSPEND_N)* 14(SUSPEND)* 16(RTS)* 19(GPIO3)* 20(GPIO2)*; Y1 1(TRI_STATE)*

### Notes on the sheet
- RADAR D79 24 V / COMPLETE ELECTRICAL SCHEMATIC / PCB v0.8.0 R9
- 01 10_POWER_INPUT
- 02 10_POWER_INPUT
- 03 10_POWER_INPUT
- 04 10_POWER_INPUT
- 05 60_HOST_UART
- 06 50_RADAR_IO_CAN
- 07 70_DEBUG_BOOT
- 08 30_TIME_GNSS
- RADAR D79 24V / PCB v0.8.0 R9 / 10 POWER INPUT
- Engineering schematic / sheet 3/31 / release 2.2.4-RC6
- RADAR D79 24V / PCB v0.8.0 R9 / 60 HOST UART
- RADAR D79 24V / PCB v0.8.0 R9 / 50 RADAR IO CAN
- RADAR D79 24V / PCB v0.8.0 R9 / 70 DEBUG BOOT
- RADAR D79 24V / PCB v0.8.0 R9 / 30 TIME GNSS
- Engineering schematic / sheet 1/31 / release 2.2.4-RC6
- Engineering schematic / sheet 2/31 / release 2.2.4-RC6
- Engineering schematic / sheet 4/31 / release 2.2.4-RC6
- Engineering schematic / sheet 5/31 / release 2.2.4-RC6
- Engineering schematic / sheet 6/31 / release 2.2.4-RC6
- Engineering schematic / sheet 7/31 / release 2.2.4-RC6
- Engineering schematic / sheet 8/31 / release 2.2.4-RC6
- SYS_EFUSE_FLT
- RADAR_EFUSE_FLT
- RADAR_CANL
- BOOT0
- NRST
- HOST_UART2_RX
- HOST_UART2_TX
- RADAR_CANH
- GNSS_TX_EXT
- HOST_UART1_RX
- HOST_UART1_TX
- CAN_RX
- CAN_TX
- RADAR_12V
- GNSS_PPS
- GNSS_RX_EXT
- GND
- 3V3
- 13 Radar_interfaces_and_QSPI
- RADAR D79 24V / PCB v0.8.0 R9 / Radar interfaces and QSPI
- Engineering schematic / sheet 13/31 / release 2.2.4-RC6
- 09 20_MCU_CORE
- 10 20_MCU_CORE
- 11 20_MCU_CORE
- 12 40_IMU
- 14 Radar_interfaces_and_QSPI
- 15 Radar_interfaces_and_QSPI
- 16 Radar_service_USB_and_boot
- RADAR D79 24V / PCB v0.8.0 R9 / 20 MCU CORE
- Engineering schematic / sheet 9/31 / release 2.2.4-RC6
- RADAR D79 24V / PCB v0.8.0 R9 / 40 IMU
- RADAR D79 24V / PCB v0.8.0 R9 / Radar service USB and boot
- Engineering schematic / sheet 10/31 / release 2.2.4-RC6
- Engineering schematic / sheet 11/31 / release 2.2.4-RC6
- Engineering schematic / sheet 12/31 / release 2.2.4-RC6
- Engineering schematic / sheet 14/31 / release 2.2.4-RC6
- Engineering schematic / sheet 15/31 / release 2.2.4-RC6
- Engineering schematic / sheet 16/31 / release 2.2.4-RC6
- TI_SW_B2
- TI_SW_B3
- TI_SYNCCLKIN
- TI_VBGAP
- TI_VPP_1P7
- TI_SOP1_MSS_SPIB_CS2
- TI_SW_B1
- TI_PMIC_EN
- TI_PMIC_NINT
- TI_NetC123_2
- TI_NetR63_1
- TI_NetL1_1
- TI_NetTP8_1
- TI_NetR186_1
- TI_NRSTOUT
- TI_NetR190_2
- TI_NetR193_1
- TI_NetR298_1
- TI_NetR386_2
- USB_CTS_N
- TI_AR_NRST
- USB_VBUS
- TI_FB_B1
- USB_VBUS_SENSE
- TI_FB_B2
- USB_WAKE_N
- TI_FB_B3
- TI_+3.3VD
- TI_AGND
- TI_AR_NERROUT
- TI_NERR_MCU
- TI_SOP3_MSS_UARTB_TX
- TI_SOP4_MSS_UARTA_TX
- USB_BRIDGE_RESET_N
- TI_1V8
- TI_3V3
- TI_3V3_VIO
- TI_1V0
- TI_5V0
- TI_1V2
- TI_1V4_APLL
- TI_PVIN3V3
- TI_1V4_SYNTH
- 17 Radar_service_USB_and_boot
- 18 Radar_service_USB_and_boot
- 19 Radar_12V_to_3V3
- 20 Radar_12V_to_3V3
- 21 Radar_input_and_reference
- 22 Radar_bypass
- 23 Radar_bypass
- 24 Radar_bypass
- Engineering schematic / sheet 17/31 / release 2.2.4-RC6
- RADAR D79 24V / PCB v0.8.0 R9 / Radar 12V to 3V3
- Engineering schematic / sheet 19/31 / release 2.2.4-RC6
- RADAR D79 24V / PCB v0.8.0 R9 / Radar input and reference
- RADAR D79 24V / PCB v0.8.0 R9 / Radar bypass
- Engineering schematic / sheet 23/31 / release 2.2.4-RC6
- Engineering schematic / sheet 18/31 / release 2.2.4-RC6
- Engineering schematic / sheet 20/31 / release 2.2.4-RC6
- Engineering schematic / sheet 21/31 / release 2.2.4-RC6
- Engineering schematic / sheet 22/31 / release 2.2.4-RC6
- Engineering schematic / sheet 24/31 / release 2.2.4-RC6
- TI_MSS_I2CA_SCL
- TI_MSS_I2CA_SDA
- TI_PMICOUT_1V8
- TI_REGOUT_3V3
- 25 Radar_PMIC_and_rail_filters
- 26 Radar_PMIC_and_rail_filters
- 27 Radar_PMIC_and_rail_filters
- 28 Radar_PMIC_and_rail_filters
- 29 Radar_rail_selection_and_sensing
- 30 Radar_rail_selection_and_sensing
- 31 Radar_VPP_service
- RADAR D79 24V / PCB v0.8.0 R9 / Radar PMIC and rail filters
- RADAR D79 24V / PCB v0.8.0 R9 / Radar rail selection and sensing
- RADAR D79 24V / PCB v0.8.0 R9 / Radar VPP service
- Engineering schematic / sheet 25/31 / release 2.2.4-RC6
- Engineering schematic / sheet 26/31 / release 2.2.4-RC6
- Engineering schematic / sheet 27/31 / release 2.2.4-RC6
- Engineering schematic / sheet 28/31 / release 2.2.4-RC6
- Engineering schematic / sheet 29/31 / release 2.2.4-RC6
- Engineering schematic / sheet 30/31 / release 2.2.4-RC6
- Engineering schematic / sheet 31/31 / release 2.2.4-RC6
- RF FRONT END AND PRINTED ANTENNA
- AWR2944P / coherent 4 TX + 4 RX / 8 patches per channel
- TX1
- B3
- TI_TX1
- RAD_U29
- TX2
- B5
- TI_TX2
- TI_TX3
- AWR2944P
- TX3
- B7
- TI_TX4
- FMCW
- TX4
- B9
- RF
- RX1
- M2
- TI_RX1
- RX2
- K2
- TI_RX2
- RX3
- H2
- TI_RX3
- RX4
- F2
- TI_RX4
- 50 ohm RF feeds and matching geometry are defined by PCB rules.